# EAGLE design PCB V1 (EAGLE 9.7.0)
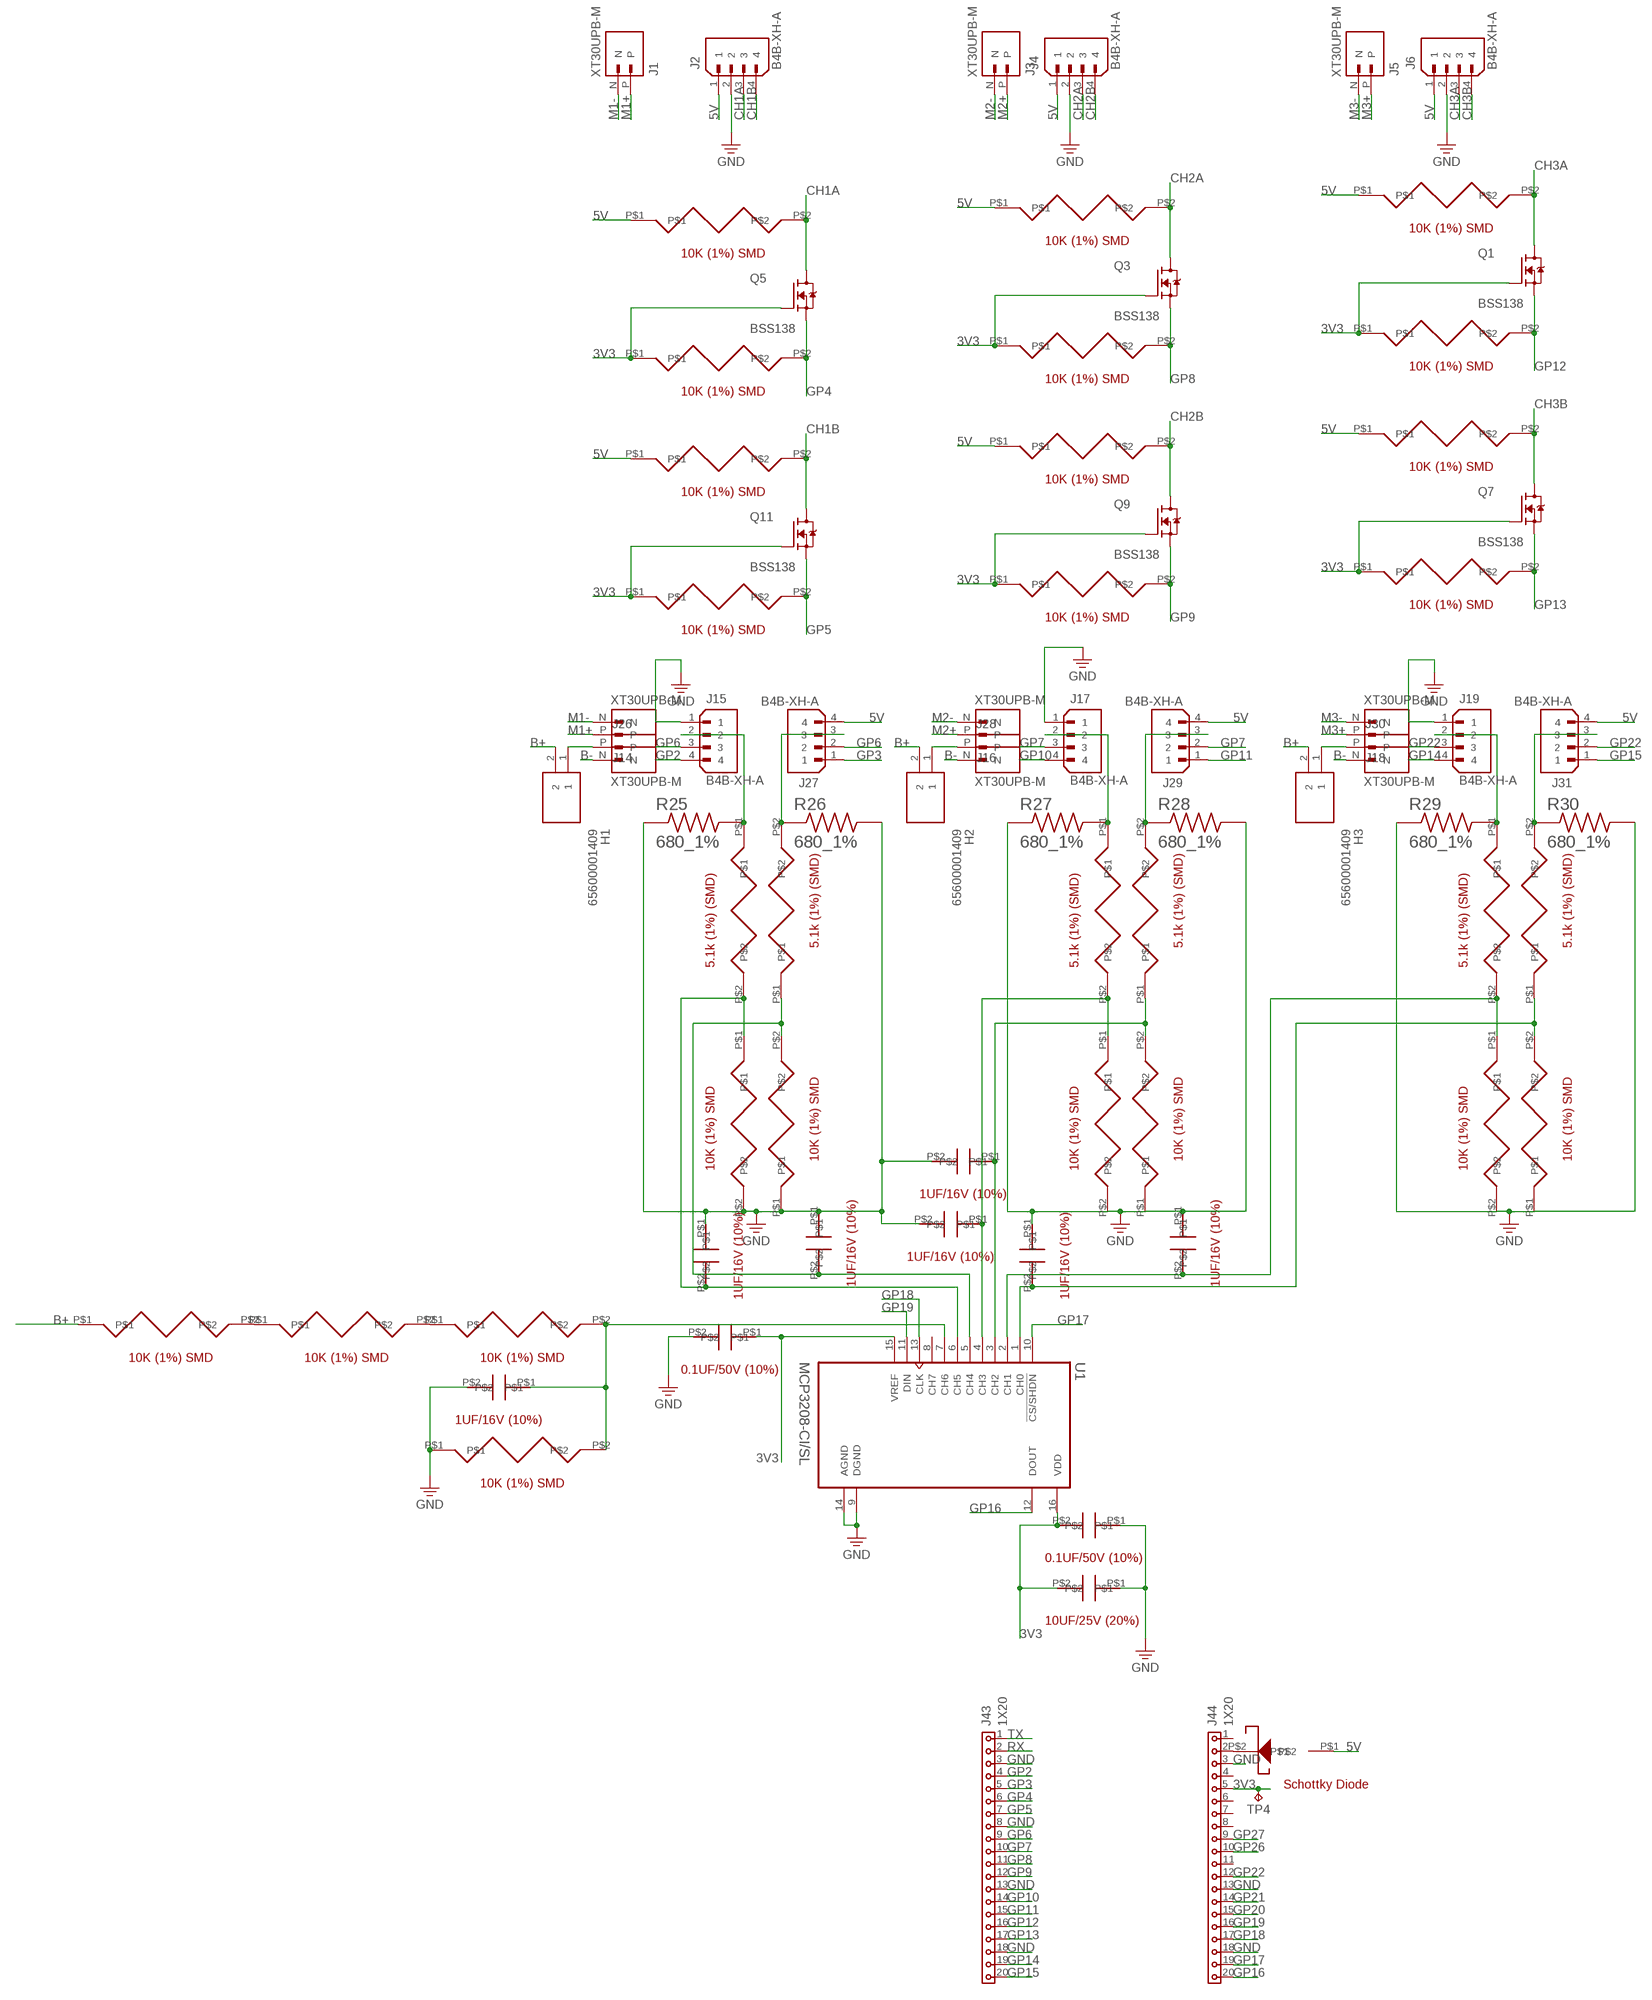
[diagram p0: schematic, sheet 1, part 1 of 2]
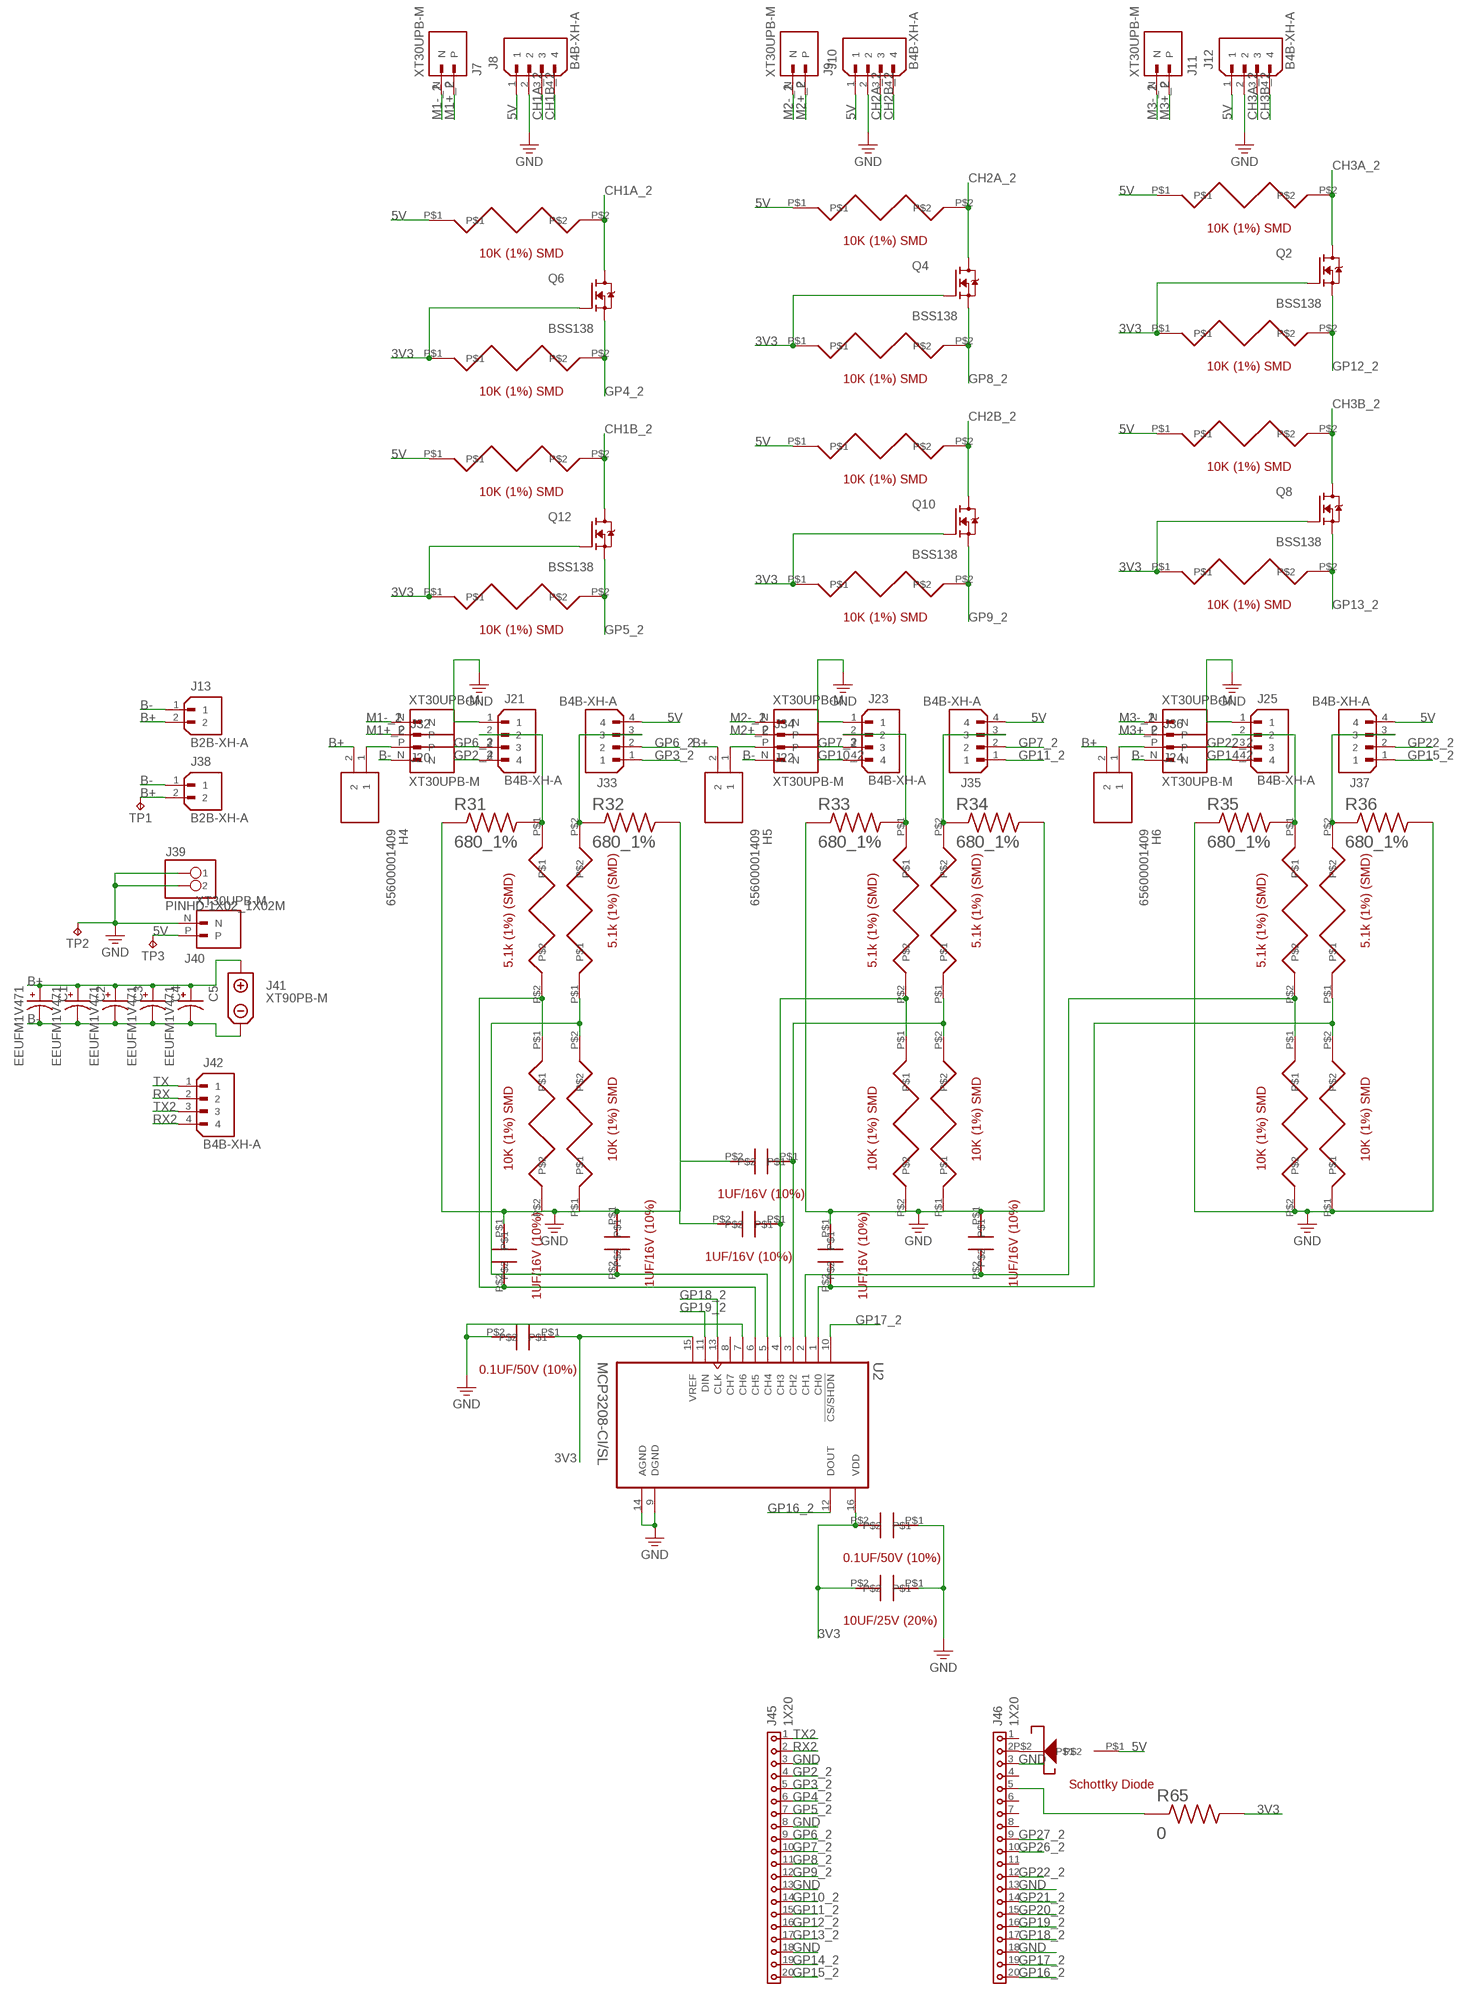
[diagram p1: schematic, sheet 1, part 2 of 2]

## Parts
C1  EEUFM1V471  [EEU-FM1V471]
C2  EEUFM1V471  [EEU-FM1V471]
C3  EEUFM1V471  [EEU-FM1V471]
C4  EEUFM1V471  [EEU-FM1V471]
C5  EEUFM1V471  [EEU-FM1V471]
C6  1UF/16V_10%  [1UF/16V_10%]
C7  1UF/16V_10%  [1UF/16V_10%]
C8  1UF/16V_10%  [1UF/16V_10%]
C9  1UF/16V_10%  [1UF/16V_10%]
C10  1UF/16V_10%  [1UF/16V_10%]
C11  1UF/16V_10%  [1UF/16V_10%]
C12  1UF/16V_10%  [1UF/16V_10%]
C13  1UF/16V_10%  [1UF/16V_10%]
C14  1UF/16V_10%  [1UF/16V_10%]
C15  1UF/16V_10%  [1UF/16V_10%]
C16  1UF/16V_10%  [1UF/16V_10%]
C17  1UF/16V_10%  [1UF/16V_10%]
C18  0.1UF/50V_10%  [0.1UF/50V_10%]
C19  0.1UF/50V_10%  [0.1UF/50V_10%]
C20  1UF/16V_10%  [1UF/16V_10%]
C21  0.1UF/50V_10%  [0.1UF/50V_10%]
C22  0.1UF/50V_10%  [0.1UF/50V_10%]
C23  10UF/25V_20%  [10UF/25V_20%]
C24  10UF/25V_20%  [10UF/25V_20%]
D1  1N5820_DIODE  [1N5820_DIODE]
D2  1N5820_DIODE  [1N5820_DIODE]
H1  65600001409  [65600001409]
H2  65600001409  [65600001409]
H3  65600001409  [65600001409]
H4  65600001409  [65600001409]
H5  65600001409  [65600001409]
H6  65600001409  [65600001409]
J1  XT30UPB-M  [XT30UPB-M]
J2  B4B-XH-A  [B4B-XH-A]
J3  XT30UPB-M  [XT30UPB-M]
J4  B4B-XH-A  [B4B-XH-A]
J5  XT30UPB-M  [XT30UPB-M]
J6  B4B-XH-A  [B4B-XH-A]
J7  XT30UPB-M  [XT30UPB-M]
J8  B4B-XH-A  [B4B-XH-A]
J9  XT30UPB-M  [XT30UPB-M]
J10  B4B-XH-A  [B4B-XH-A]
J11  XT30UPB-M  [XT30UPB-M]
J12  B4B-XH-A  [B4B-XH-A]
J13  B2B-XH-A  [B2B-XH-A]
J14  XT30UPB-M  [XT30UPB-M]
J15  B4B-XH-A  [B4B-XH-A]
J16  XT30UPB-M  [XT30UPB-M]
J17  B4B-XH-A  [B4B-XH-A]
J18  XT30UPB-M  [XT30UPB-M]
J19  B4B-XH-A  [B4B-XH-A]
J20  XT30UPB-M  [XT30UPB-M]
J21  B4B-XH-A  [B4B-XH-A]
J22  XT30UPB-M  [XT30UPB-M]
J23  B4B-XH-A  [B4B-XH-A]
J24  XT30UPB-M  [XT30UPB-M]
J25  B4B-XH-A  [B4B-XH-A]
J26  XT30UPB-M  [XT30UPB-M]
J27  B4B-XH-A  [B4B-XH-A]
J28  XT30UPB-M  [XT30UPB-M]
J29  B4B-XH-A  [B4B-XH-A]
J30  XT30UPB-M  [XT30UPB-M]
J31  B4B-XH-A  [B4B-XH-A]
J32  XT30UPB-M  [XT30UPB-M]
J33  B4B-XH-A  [B4B-XH-A]
J34  XT30UPB-M  [XT30UPB-M]
J35  B4B-XH-A  [B4B-XH-A]
J36  XT30UPB-M  [XT30UPB-M]
J37  B4B-XH-A  [B4B-XH-A]
J38  B2B-XH-A  [B2B-XH-A]
J39  PINHD-1X02_1X02M  [1X02]
J40  XT30UPB-M  [XT30UPB-M]
J41  XT90PB-M  [XT90PB-M]
J42  B4B-XH-A  [B4B-XH-A]
J43  1X20  [1X20]
J44  1X20  [1X20]
J45  1X20  [1X20]
J46  1X20  [1X20]
Q1  BSS138  [BSS138]
Q2  BSS138  [BSS138]
Q3  BSS138  [BSS138]
Q4  BSS138  [BSS138]
Q5  BSS138  [BSS138]
Q6  BSS138  [BSS138]
Q7  BSS138  [BSS138]
Q8  BSS138  [BSS138]
Q9  BSS138  [BSS138]
Q10  BSS138  [BSS138]
Q11  BSS138  [BSS138]
Q12  BSS138  [BSS138]
R1  10K_1%_SMD  [10K_1%_SMD]
R2  10K_1%_SMD  [10K_1%_SMD]
R3  10K_1%_SMD  [10K_1%_SMD]
R4  10K_1%_SMD  [10K_1%_SMD]
R5  10K_1%_SMD  [10K_1%_SMD]
R6  10K_1%_SMD  [10K_1%_SMD]
R7  10K_1%_SMD  [10K_1%_SMD]
R8  10K_1%_SMD  [10K_1%_SMD]
R9  10K_1%_SMD  [10K_1%_SMD]
R10  10K_1%_SMD  [10K_1%_SMD]
R11  10K_1%_SMD  [10K_1%_SMD]
R12  10K_1%_SMD  [10K_1%_SMD]
R13  10K_1%_SMD  [10K_1%_SMD]
R14  10K_1%_SMD  [10K_1%_SMD]
R15  10K_1%_SMD  [10K_1%_SMD]
R16  10K_1%_SMD  [10K_1%_SMD]
R17  10K_1%_SMD  [10K_1%_SMD]
R18  10K_1%_SMD  [10K_1%_SMD]
R19  10K_1%_SMD  [10K_1%_SMD]
R20  10K_1%_SMD  [10K_1%_SMD]
R21  10K_1%_SMD  [10K_1%_SMD]
R22  10K_1%_SMD  [10K_1%_SMD]
R23  10K_1%_SMD  [10K_1%_SMD]
R24  10K_1%_SMD  [10K_1%_SMD]
R25  680_1%  [680_1%]
R26  680_1%  [680_1%]
R27  680_1%  [680_1%]
R28  680_1%  [680_1%]
R29  680_1%  [680_1%]
R30  680_1%  [680_1%]
R31  680_1%  [680_1%]
R32  680_1%  [680_1%]
R33  680_1%  [680_1%]
R34  680_1%  [680_1%]
R35  680_1%  [680_1%]
R36  680_1%  [680_1%]
R37  5.1K_1%_SMD  [5.1K_1%_SMD]
R38  5.1K_1%_SMD  [5.1K_1%_SMD]
R39  5.1K_1%_SMD  [5.1K_1%_SMD]
R40  5.1K_1%_SMD  [5.1K_1%_SMD]
R41  5.1K_1%_SMD  [5.1K_1%_SMD]
R42  5.1K_1%_SMD  [5.1K_1%_SMD]
R43  5.1K_1%_SMD  [5.1K_1%_SMD]
R44  5.1K_1%_SMD  [5.1K_1%_SMD]
R45  5.1K_1%_SMD  [5.1K_1%_SMD]
R46  5.1K_1%_SMD  [5.1K_1%_SMD]
R47  5.1K_1%_SMD  [5.1K_1%_SMD]
R48  5.1K_1%_SMD  [5.1K_1%_SMD]
R49  10K_1%_SMD  [10K_1%_SMD]
R50  10K_1%_SMD  [10K_1%_SMD]
R51  10K_1%_SMD  [10K_1%_SMD]
R52  10K_1%_SMD  [10K_1%_SMD]
R53  10K_1%_SMD  [10K_1%_SMD]
R54  10K_1%_SMD  [10K_1%_SMD]
R55  10K_1%_SMD  [10K_1%_SMD]
R56  10K_1%_SMD  [10K_1%_SMD]
R57  10K_1%_SMD  [10K_1%_SMD]
R58  10K_1%_SMD  [10K_1%_SMD]
R59  10K_1%_SMD  [10K_1%_SMD]
R60  10K_1%_SMD  [10K_1%_SMD]
R61  10K_1%_SMD  [10K_1%_SMD]
R62  10K_1%_SMD  [10K_1%_SMD]
R63  10K_1%_SMD  [10K_1%_SMD]
R64  10K_1%_SMD  [10K_1%_SMD]
R65  0  RC0603JR-070RL  [RESC1607X60N]
TP1  TPTP127R  [TP127R]
TP2  TPTP127R  [TP127R]
TP3  TPTP127R  [TP127R]
TP4  TPTP127R  [TP127R]
U1  MCP3208-CI/SL  [MCP3208-CI/SL]
U2  MCP3208-CI/SL  [MCP3208-CI/SL]

## Nets
3V3: C18.P$1 C19.P$1 C21.P$2 C22.P$2 C23.P$2 C24.P$2 J44.5 Q1.1(G) Q2.1(G) Q3.1(G) Q4.1(G) Q5.1(G) Q6.1(G) Q7.1(G) Q8.1(G) Q9.1(G) Q10.1(G) Q11.1(G) Q12.1(G) R7.P$1 R8.P$1 R9.P$1 R10.P$1 R11.P$1 R12.P$1 R19.P$1 R20.P$1 R21.P$1 R22.P$1 R23.P$1 R24.P$1 R65.2 TP4.TP U1.15(VREF) U1.16(VDD) U2.15(VREF) U2.16(VDD)
5V [5v]: D1.P$1 D2.P$1 J2.1 J4.1 J6.1 J8.1 J10.1 J12.1 J27.4 J29.4 J31.4 J33.4 J35.4 J37.4 J40.P R1.P$1 R2.P$1 R3.P$1 R4.P$1 R5.P$1 R6.P$1 R13.P$1 R14.P$1 R15.P$1 R16.P$1 R17.P$1 R18.P$1 TP3.TP
B+ [battery]: C1.P C2.P C3.P C4.P C5.P H1.2 H2.2 H3.2 H4.2 H5.2 H6.2 J13.2 J38.2 J41.+ R61.P$1 TP1.TP
B- [battery]: C1.N C2.N C3.N C4.N C5.N J13.1 J26.N J28.N J30.N J32.N J34.N J36.N J38.1 J41.-
CH1A: J2.3 Q5.3(D) R5.P$2
CH1A_2: J8.3 Q6.3(D) R6.P$2
CH1B: J2.4 Q11.3(D) R17.P$2
CH1B_2: J8.4 Q12.3(D) R18.P$2
CH2A: J4.3 Q3.3(D) R3.P$2
CH2A_2: J10.3 Q4.3(D) R4.P$2
CH2B: J4.4 Q9.3(D) R15.P$2
CH2B_2: J10.4 Q10.3(D) R16.P$2
CH3A: J6.3 Q1.3(D) R1.P$2
CH3A_2: J12.3 Q2.3(D) R2.P$2
CH3B: J6.4 Q7.3(D) R13.P$2
CH3B_2: J12.4 Q8.3(D) R14.P$2
GND: C6.P$2 C7.P$2 C8.P$1 C9.P$1 C10.P$1 C11.P$1 C12.P$1 C13.P$2 C14.P$1 C15.P$1 C16.P$2 C17.P$1 C18.P$2 C19.P$2 C20.P$2 C21.P$1 C22.P$1 C23.P$1 C24.P$1 J2.2 J4.2 J6.2 J8.2 J10.2 J12.2 J15.1 J17.1 J19.1 J21.1 J23.1 J25.1 J39.1 J39.2 J40.N J43.3 J43.8 J43.13 J43.18 J44.3 J44.13 J44.18 J45.3 J45.8 J45.13 J45.18 J46.3 J46.13 J46.18 R25.1 R26.2 R27.1 R28.2 R29.1 R30.2 R31.1 R32.2 R33.1 R34.2 R35.1 R36.2 R49.P$2 R50.P$1 R51.P$2 R52.P$1 R53.P$2 R54.P$1 R55.P$2 R56.P$1 R57.P$2 R58.P$1 R59.P$2 R60.P$1 R64.P$1 TP2.TP U1.9(DGND) U1.14(AGND) U2.7(CH6) U2.9(DGND) U2.14(AGND)
GP2: J15.4 J43.4
GP2_2: J21.4 J45.4
GP3: J27.1 J43.5
GP3_2: J33.1 J45.5
GP4: J43.6 Q5.2(S) R11.P$2
GP4_2: J45.6 Q6.2(S) R12.P$2
GP5: J43.7 Q11.2(S) R23.P$2
GP5_2: J45.7 Q12.2(S) R24.P$2
GP6: J15.3 J27.2 J43.9
GP6_2: J21.3 J33.2 J45.9
GP7: J17.3 J29.2 J43.10
GP7_2: J23.3 J35.2 J45.10
GP8: J43.11 Q3.2(S) R9.P$2
GP8_2: J45.11 Q4.2(S) R10.P$2
GP9: J43.12 Q9.2(S) R21.P$2
GP9_2: J45.12 Q10.2(S) R22.P$2
GP10: J17.4 J43.14
GP10_2: J23.4 J45.14
GP11: J29.1 J43.15
GP11_2: J35.1 J45.15
GP12: J43.16 Q1.2(S) R7.P$2
GP12_2: J45.16 Q2.2(S) R8.P$2
GP13: J43.17 Q7.2(S) R19.P$2
GP13_2: J45.17 Q8.2(S) R20.P$2
GP14: J19.4 J43.19
GP14_2: J25.4 J45.19
GP15: J31.1 J43.20
GP15_2: J37.1 J45.20
GP16: J44.20 U1.12(DOUT)
GP16_2: J46.20 U2.12(DOUT)
GP17: J44.19 U1.10(!CS/SHDN)
GP17_2: J46.19 U2.10(!CS/SHDN)
GP18: J44.17 U1.13(CLK)
GP18_2: J46.17 U2.13(CLK)
GP19: J44.16 U1.11(DIN)
GP19_2: J46.16 U2.11(DIN)
GP20: J44.15
GP20_2: J46.15
GP21: J44.14
GP21_2: J46.14
GP22: J19.3 J31.2 J44.12
GP22_2: J25.3 J37.2 J46.12
GP26: J44.10
GP26_2: J46.10
GP27: J44.9
GP27_2: J46.9
M1+ [motor]: J1.P J14.P
M1+_2 [motor]: J7.P J20.P
M1- [motor]: J1.N J14.N
M1-_2 [motor]: J7.N J20.N
M2+ [motor]: J3.P J16.P
M2+_2 [motor]: J9.P J22.P
M2- [motor]: J3.N J16.N
M2-_2 [motor]: J9.N J22.N
M3+ [motor]: J5.P J18.P
M3+_2 [motor]: J11.P J24.P
M3- [motor]: J5.N J18.N
M3-_2 [motor]: J11.N J24.N
N$1: D1.P$2 J44.2
N$2: D2.P$2 J46.2
N$3: J17.2 R27.2 R39.P$1
N$4: J29.3 R28.1 R40.P$2
N$5: J15.2 R25.2 R37.P$1
N$6: C6.P$1 R40.P$1 R52.P$2 U1.3(CH2)
N$7: C13.P$1 R39.P$2 R51.P$1 U1.4(CH3)
N$8: J27.3 R26.1 R38.P$2
N$9: C8.P$2 R38.P$1 R50.P$2 U1.5(CH4)
N$10: C12.P$2 R37.P$2 R49.P$1 U1.6(CH5)
N$11: J19.2 R29.2 R41.P$1
N$12: J31.3 R30.1 R42.P$2
N$13: C14.P$2 R42.P$1 R54.P$2 U1.1(CH0)
N$14: C9.P$2 R41.P$2 R53.P$1 U1.2(CH1)
N$15 [battery]: H4.1 J32.P
N$16: J23.2 R33.2 R45.P$1
N$17: J35.3 R34.1 R46.P$2
N$18: C7.P$1 R46.P$1 R58.P$2 U2.3(CH2)
N$19: C16.P$1 R45.P$2 R57.P$1 U2.4(CH3)
N$20: J21.2 R31.2 R43.P$1
N$21: J33.3 R32.1 R44.P$2
N$22: C10.P$2 R44.P$1 R56.P$2 U2.5(CH4)
N$23: C15.P$2 R43.P$2 R55.P$1 U2.6(CH5)
N$24: J25.2 R35.2 R47.P$1
N$25: J37.3 R36.1 R48.P$2
N$26: C17.P$2 R48.P$1 R60.P$2 U2.1(CH0)
N$27: C11.P$2 R47.P$2 R59.P$1 U2.2(CH1)
N$28 [battery]: H5.1 J34.P
N$29 [battery]: H6.1 J36.P
N$30 [battery]: H3.1 J30.P
N$31 [battery]: H2.1 J28.P
N$32 [battery]: H1.1 J26.P
N$33: J46.5 R65.1
N$34: R62.P$2 R63.P$1
N$35: R61.P$2 R62.P$1
N$37: C20.P$1 R63.P$2 R64.P$2 U1.7(CH6)
RX: J42.2 J43.2
RX2: J42.4 J45.2
TX: J42.1 J43.1
TX2: J42.3 J45.1
Unconnected: J44.1 J44.4 J44.6 J44.7 J44.8 J44.11 J46.1 J46.4 J46.6 J46.7 J46.8 J46.11 U1.8(CH7) U2.8(CH7)

## Library data of the parts
C1-C5 = EEUFM1V471:EEUFM1V471: Check availability <https://pricing.snapeda.com/parts/EEU-FM1V471/Panasonic%20Electronic/view-part?ref=eda>
C6-C17 C20 = Custom Capacitor Library:1UF/16V_10%
C18 C19 C21 C22 = Custom Capacitor Library:0.1UF/50V_10%
C23 C24 = Custom Capacitor Library:10UF/25V_20%
D1 D2 = 1N5820_DIODE:1N5820_DIODE
H1-H6 = 65600001409:65600001409: Molded Base PC Mount Fuse Block For 5 20mm Fuses Source: Datasheet <https://www.littelfuse.com/media?resourcetype=datasheets&itemid=7143dbe7-66cc-46d0-a668-04c7d18969fc&filename=littelfuse-fuse-block-656-datasheet>
J1 J3 J5 J7 J9 J11 J14 J16 J18 J20 J22 J24 J26 J28 J30 J32 J34 J36 J40 = XT30UPB-M:XT30UPB-M
J2 J4 J6 J8 J10 J12 J15 J17 J19 J21 J23 J25 J27 J29 J31 J33 J35 J37 J42 = B4B-XH-A:B4B-XH-A
J13 J38 = B2B-XH-A:B2B-XH-A
J39 = Tinkercad:PINHD-1X02
J41 = XT30-60-90:XT90
J43-J46 = 1x20 Socket Headers:1X20
Q1-Q12 = BSS138:BSS138
R1-R24 R49-R64 = Custom Resistor Library:10K_1%_SMD
R25-R36 = 680_1%:680_1%
R37-R48 = Custom Resistor Library:5.1K_1%_SMD
R65 = RC0603JR-070RL:RC0603JR-070RL
TP1-TP4 = PCB_Utilities:TP: Test Pad
U1 U2 = MCP3208-CI_SL:MCP3208-CI/SL

## Net classes
0 default: width 0.125 mm
1 battery: width 3.75 mm, drill 0.8 mm
2 5v: width 0.25 mm
3 motor: width 3 mm, drill 0.8 mm

## Board
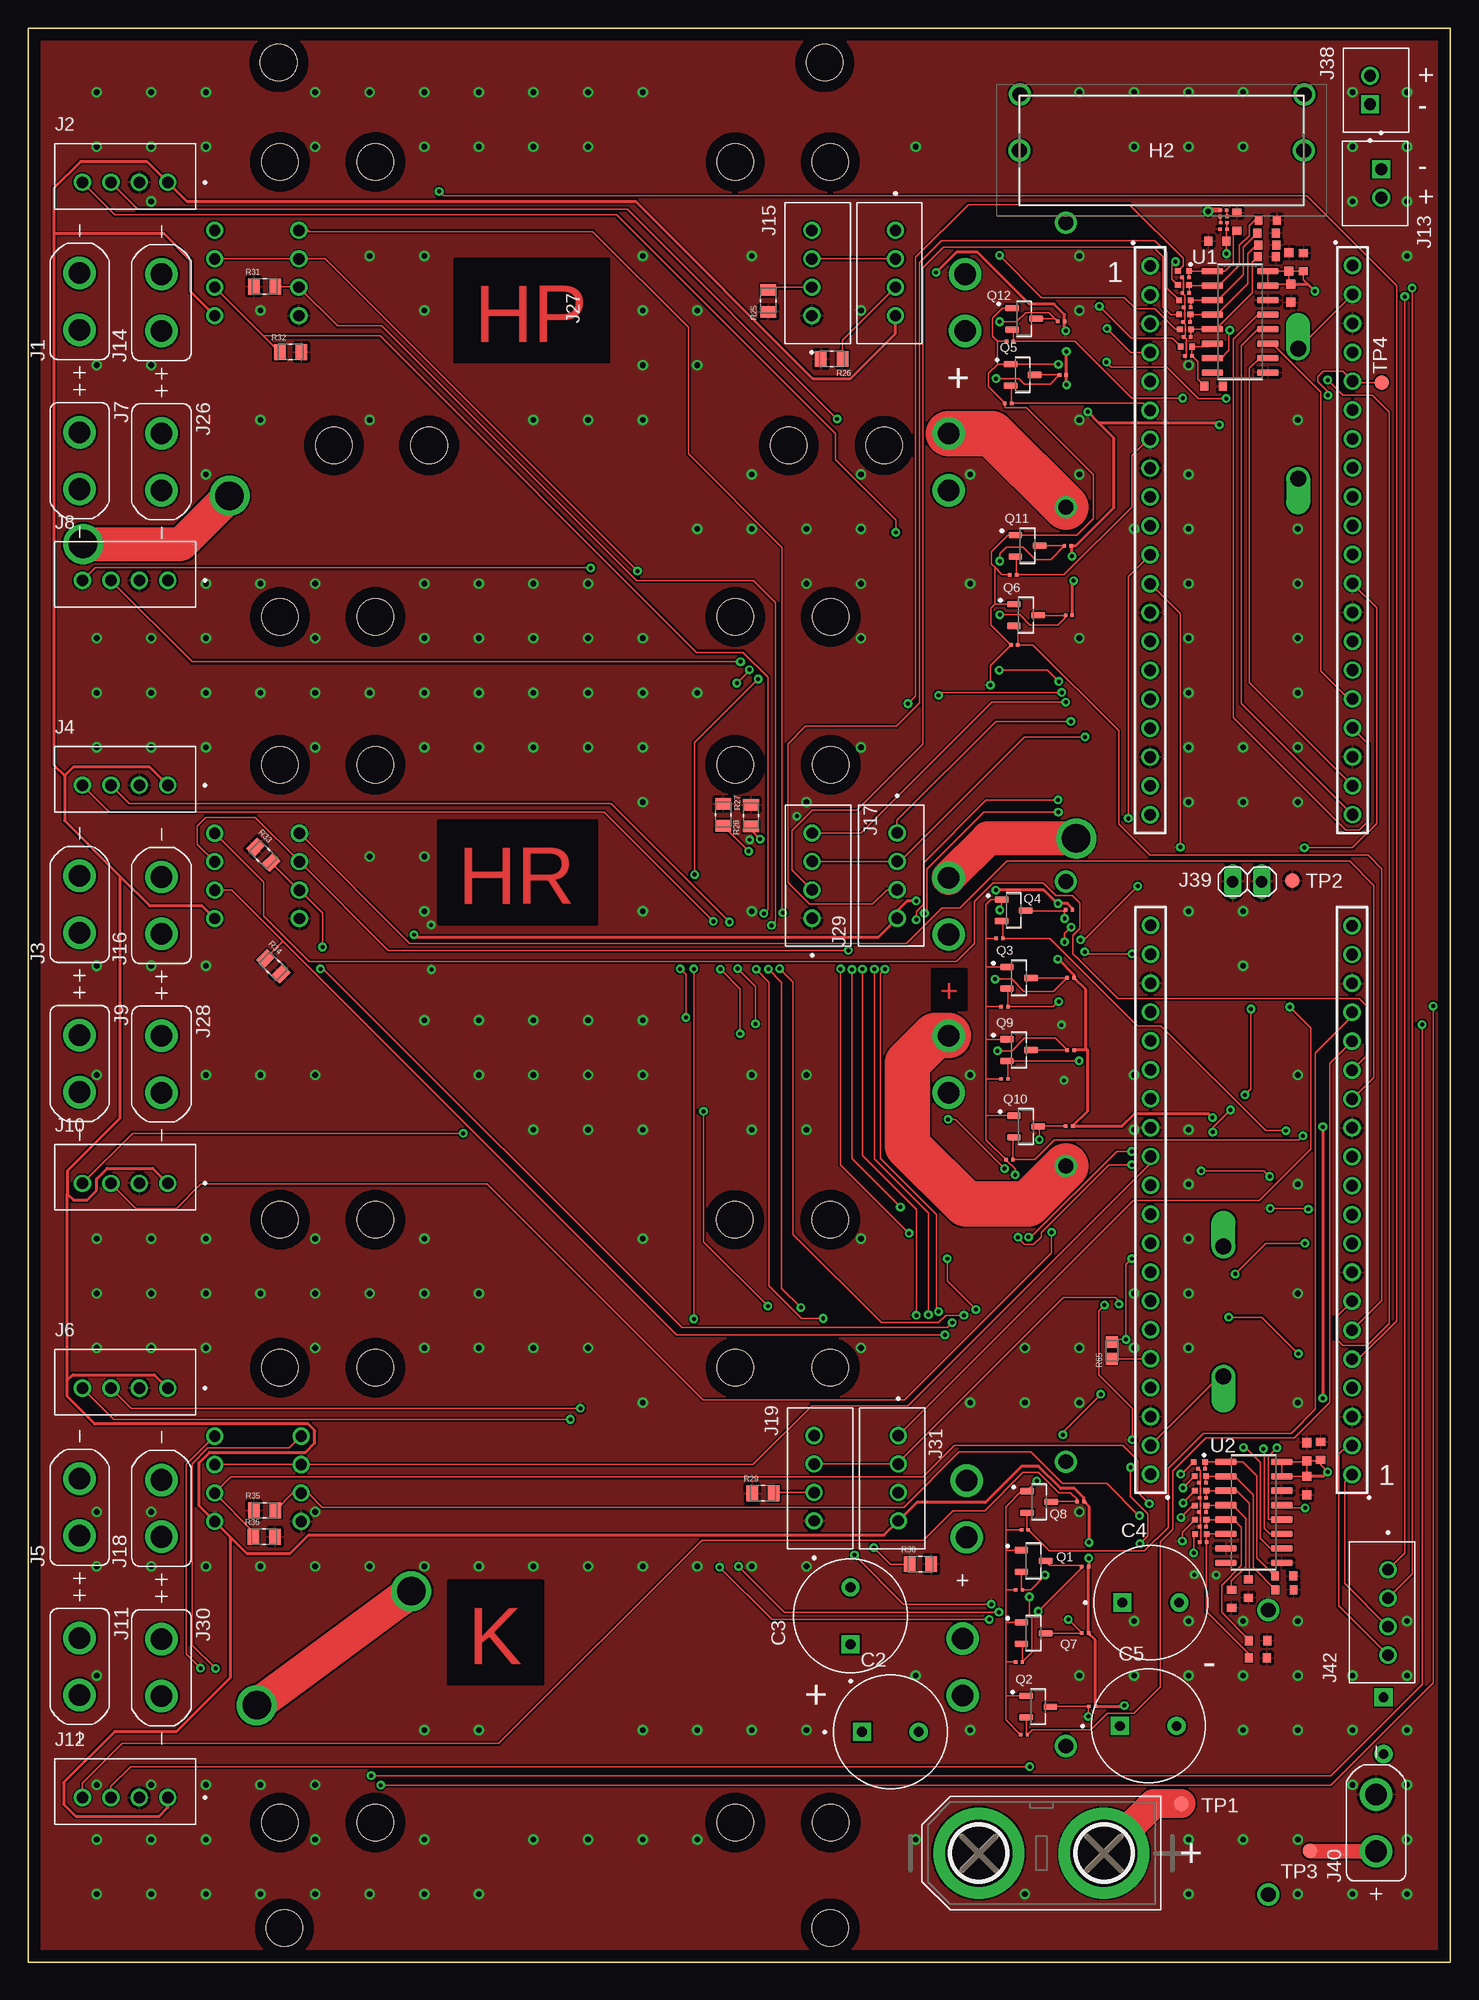
[diagram p2: board, top side]
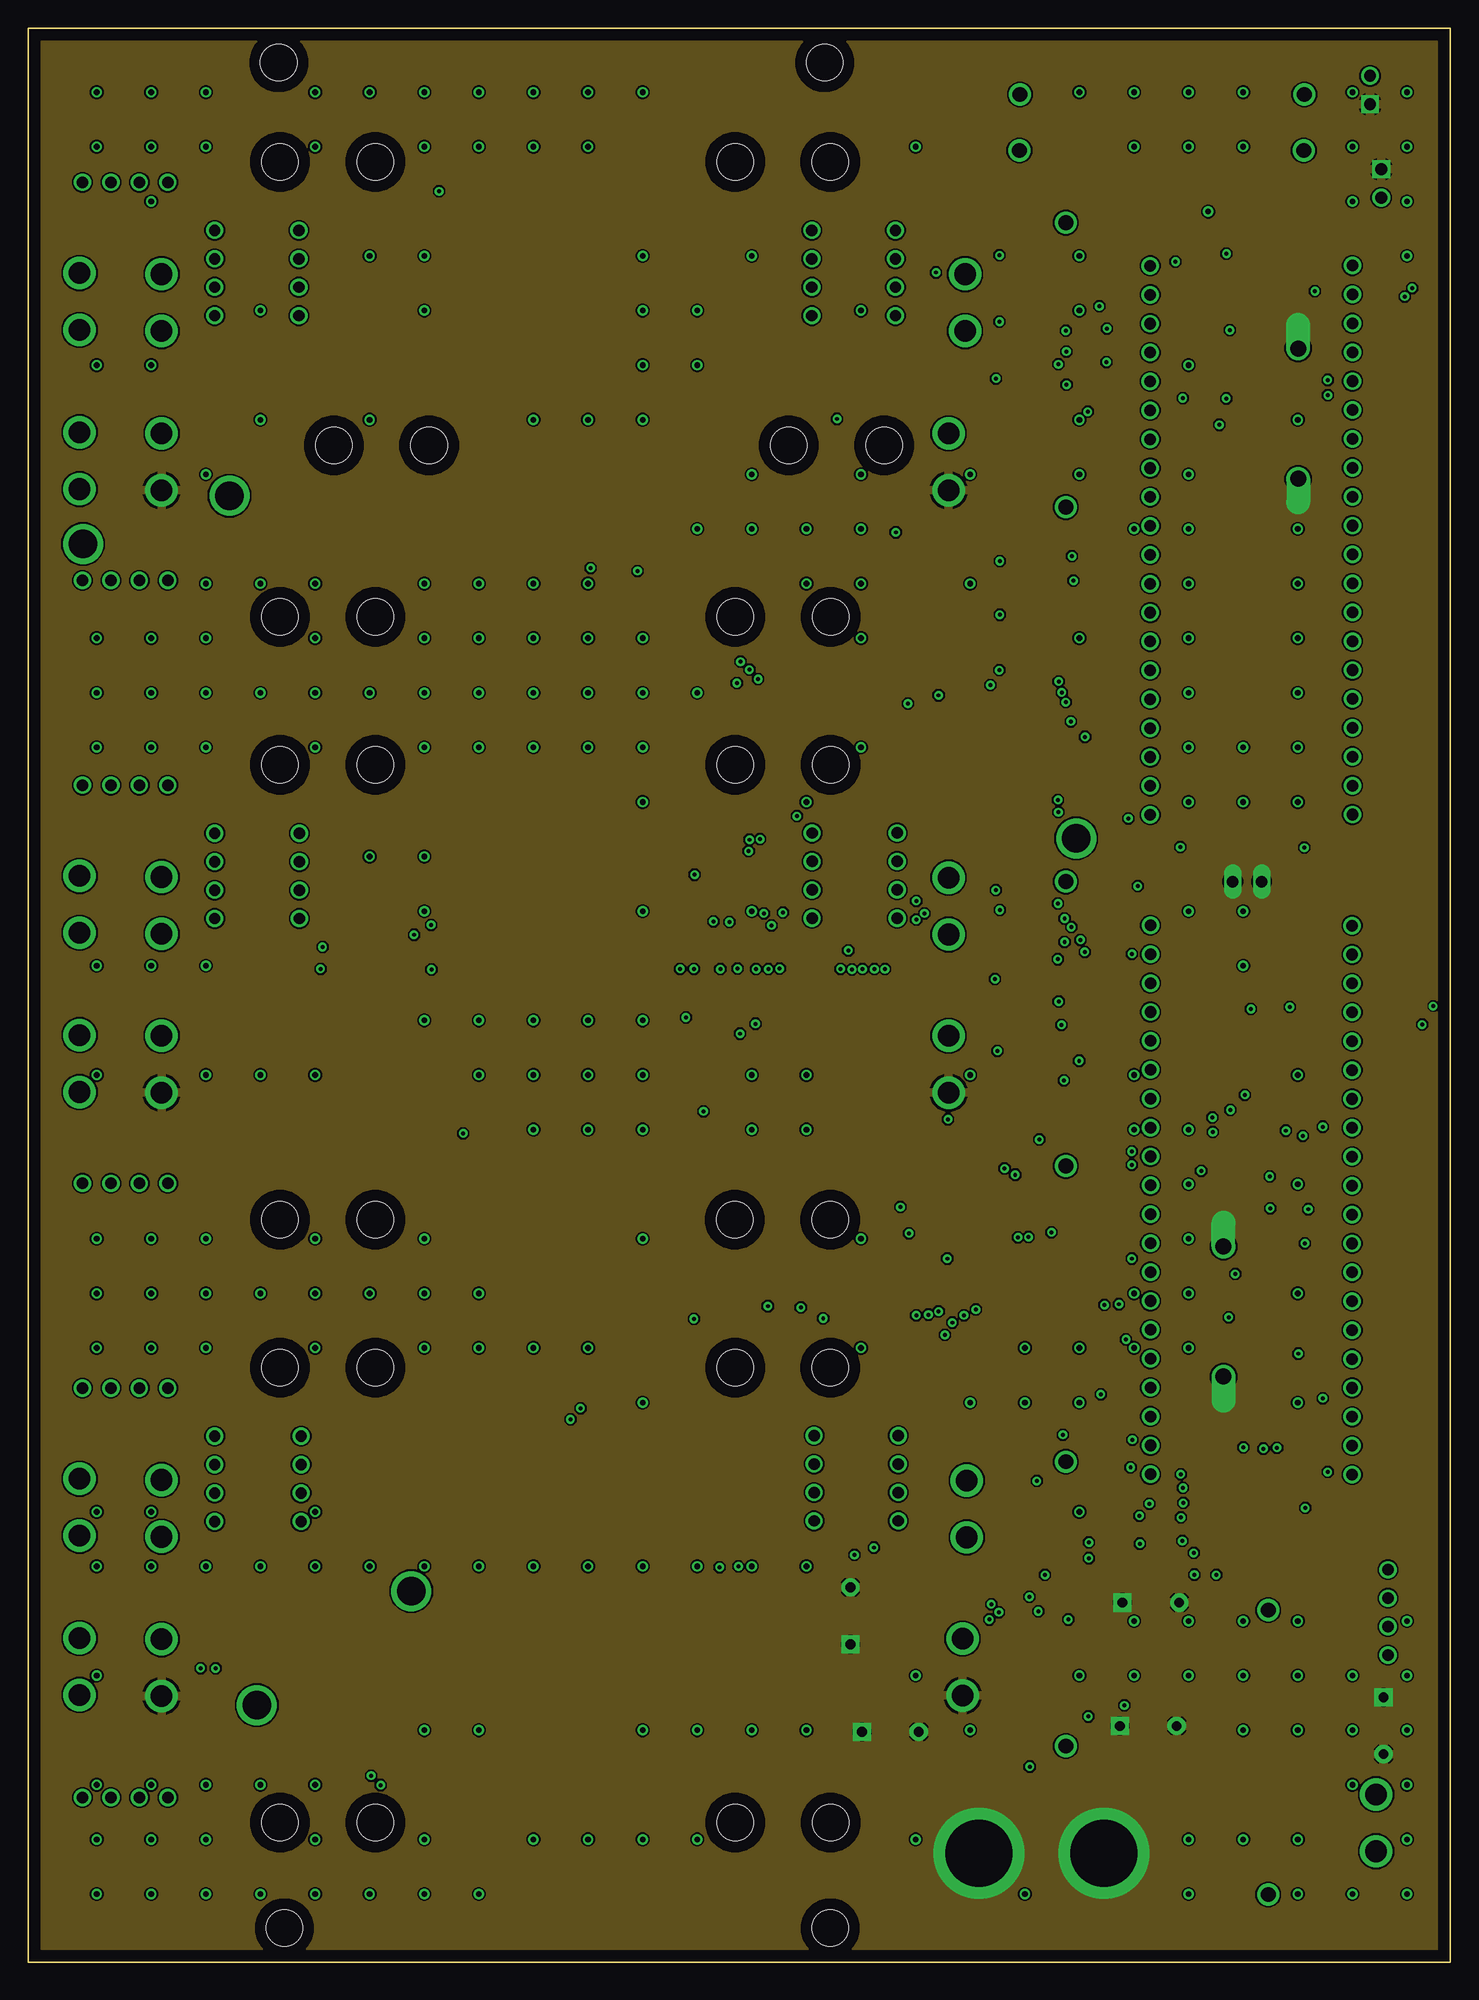
[diagram p3: board, inner layer Route2]
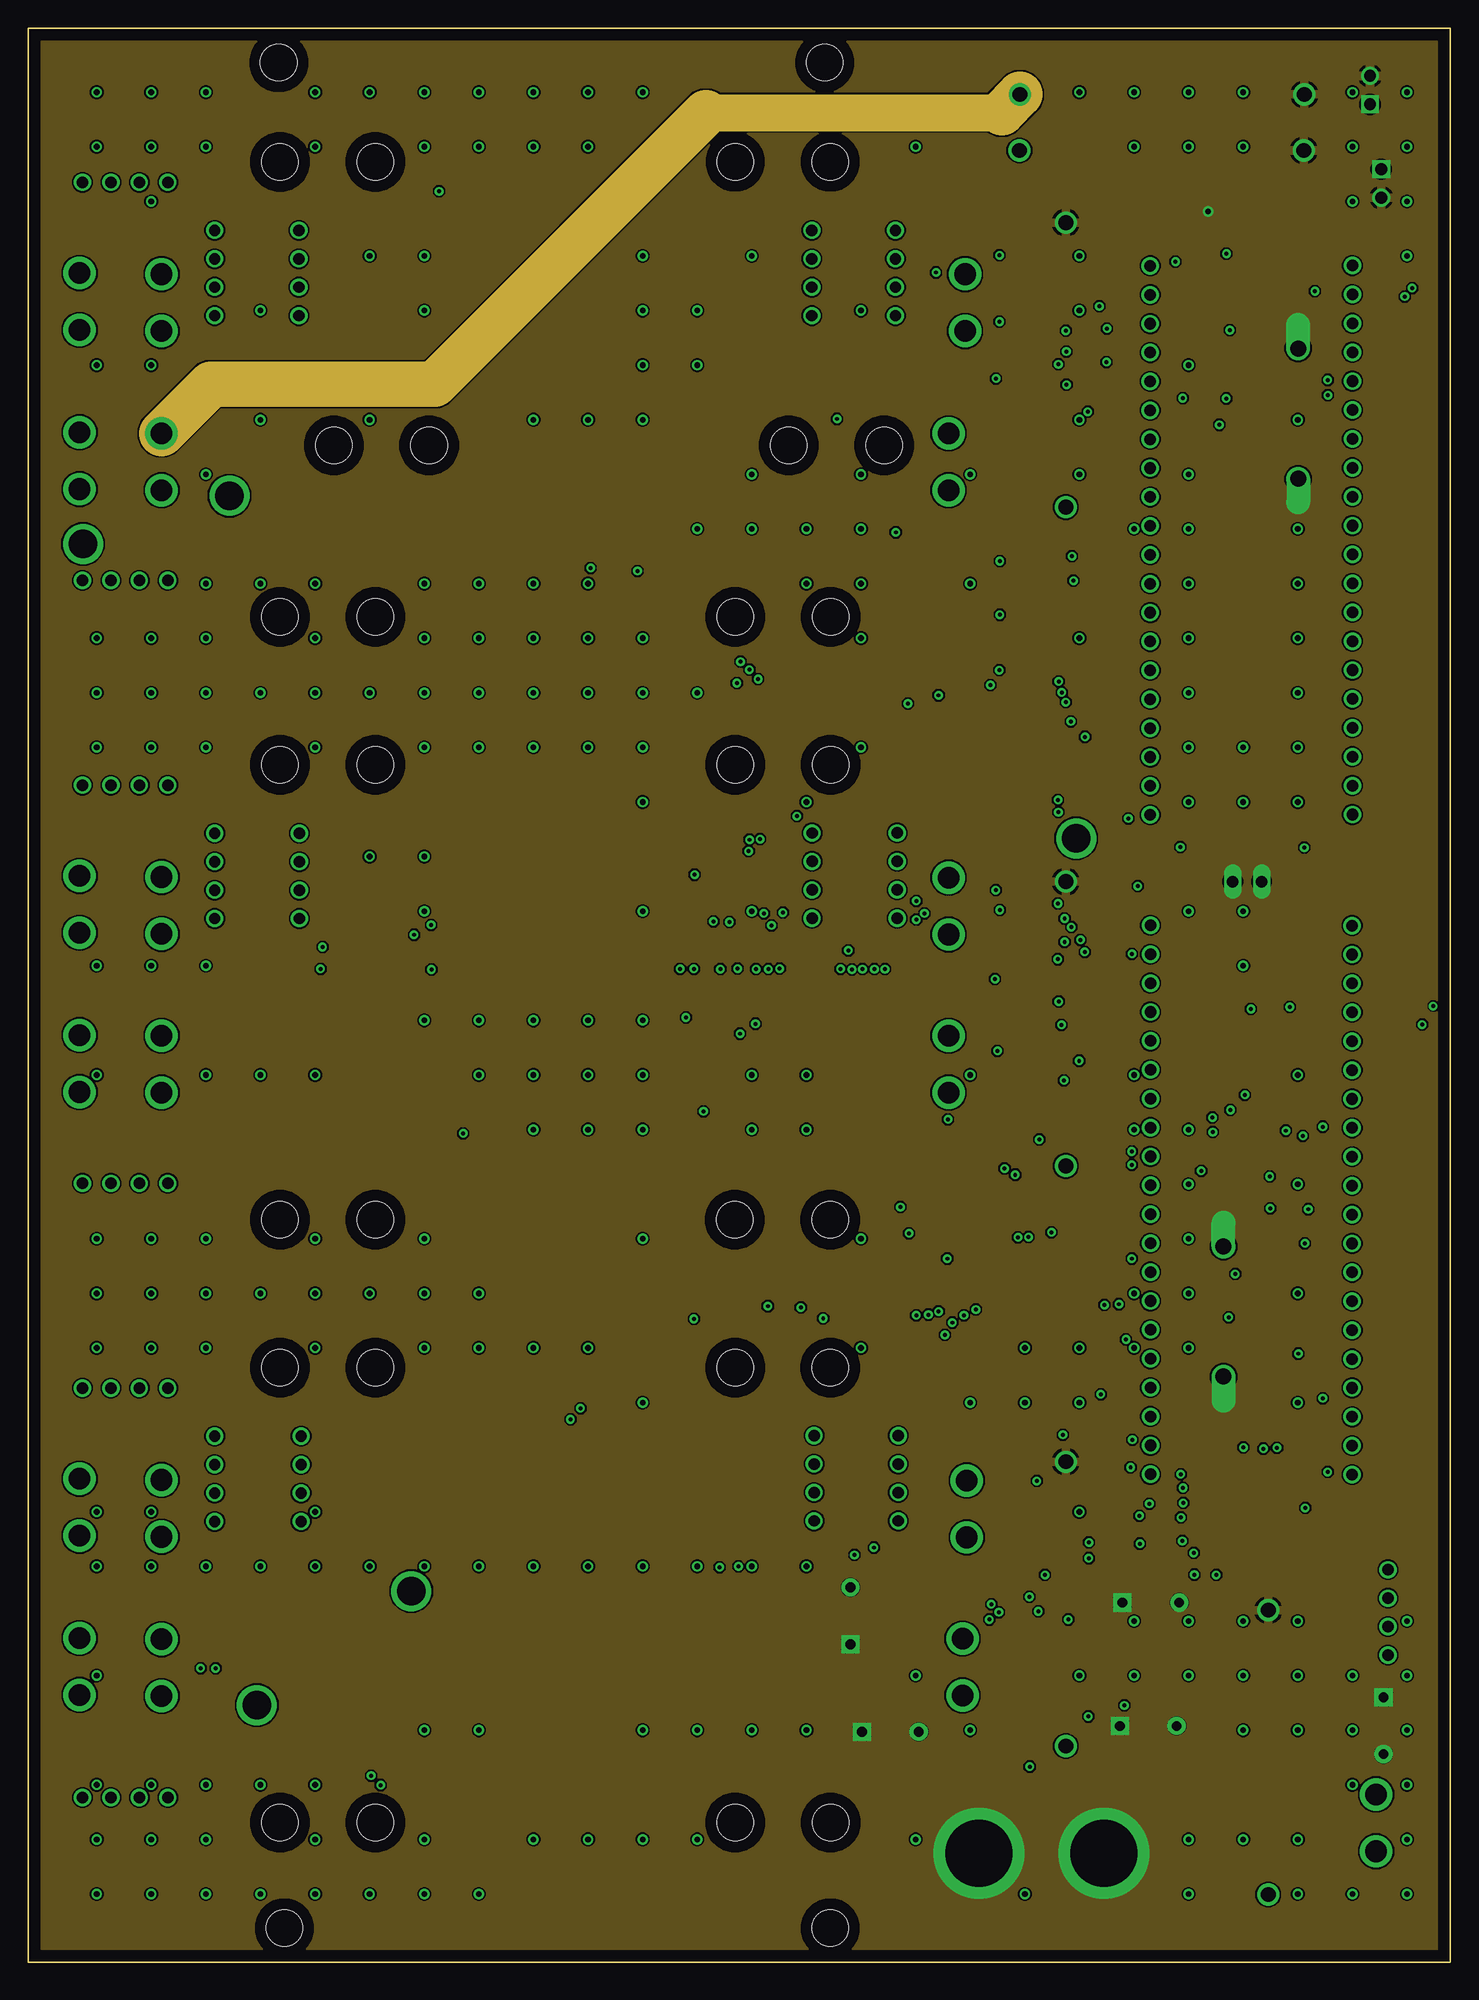
[diagram p4: board, inner layer Route63]
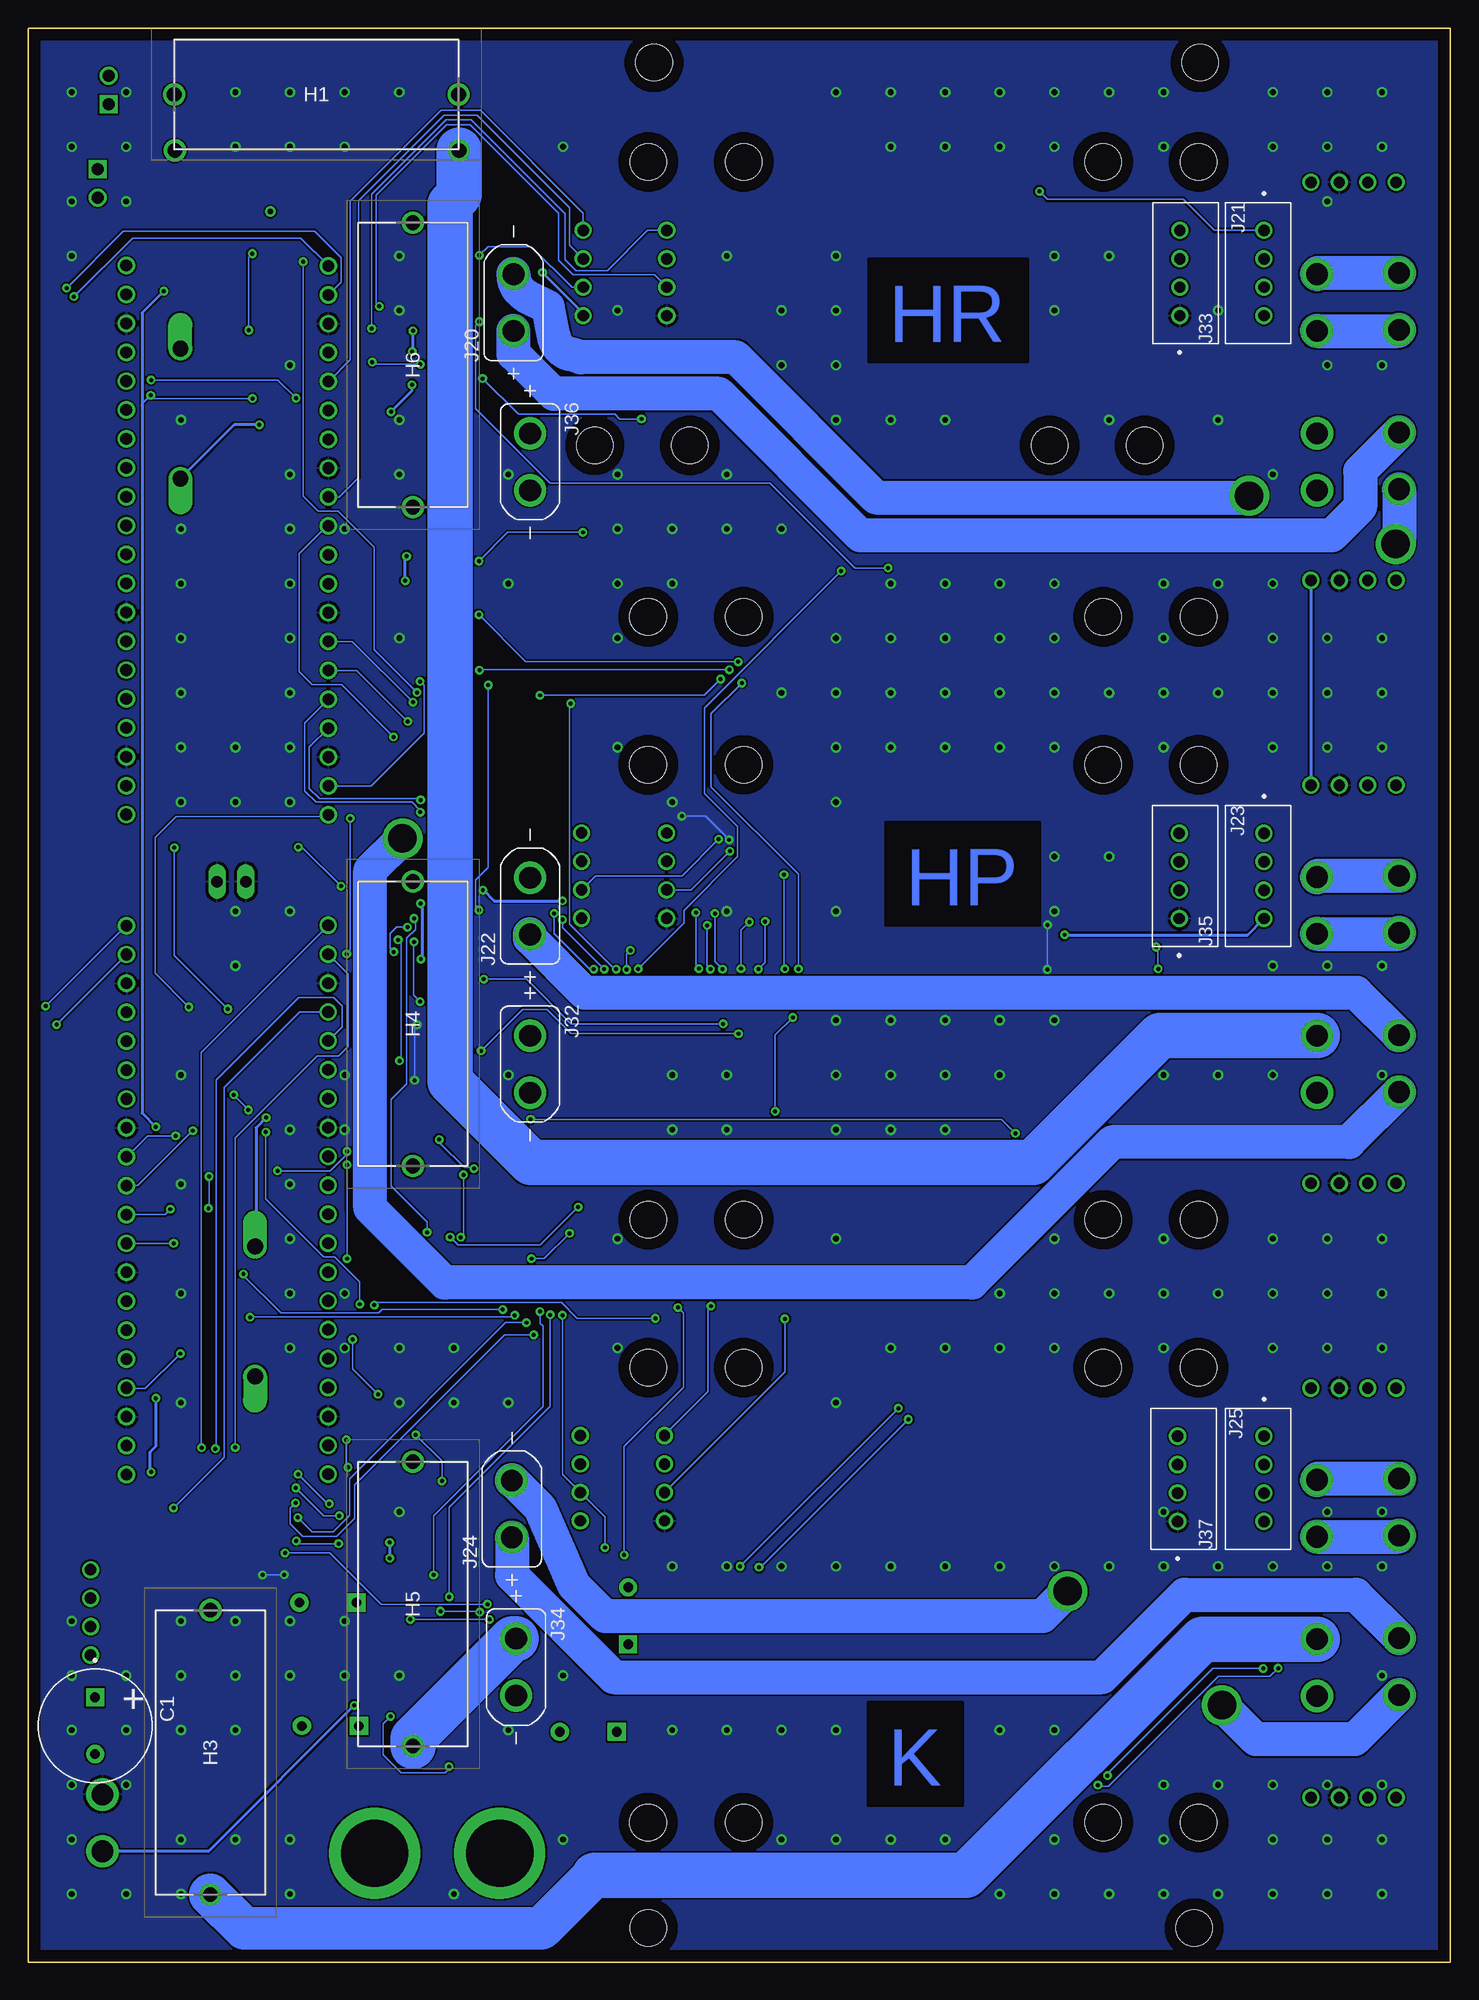
[diagram p5: board, bottom side, seen from below]

Size 125 x 170 mm. Coordinates in mm from the lower left corner, seen from the top.
Outline: 0,170 0,0 125,0 125,170 0,170
Copper layers (1+2*15+16): Top / Route2 / Route63 / Bottom
Stack-up 4 Layer Stack: Top SilkScreen Epoxy Ink / Top SolderMask User Defined 0.0254mm Dk 4.3 / Top Surface Finish Lead-Free 0.02mm / Top User Defined 0.07mm / Dielectric-1 Prepreg:001 0.064mm / Dielectric-2 Prepreg:001 0.064mm / Route2 User Defined 0.07mm / Dielectric-3 Core:066 0.711mm / Route63 User Defined 0.07mm / Dielectric-4 Prepreg:001 0.064mm / Dielectric-5 Prepreg:001 0.064mm / Bottom User Defined 0.07mm / Bottom Surface Finish Lead-Free 0.02mm / Bottom SolderMask User Defined 0.0254mm Dk 4.3 / Bottom SilkScreen Epoxy Ink
Design rules: minimum copper width classes=1 3.75mm, minimum copper width classes=3 3mm, minimum copper width classes=2 0.25mm, minimum copper width classes=0 0.125mm, minimum copper width 6mil, minimum drill size classes=1,3 0.8mm, minimum drill size 0.35mm, copper clearance wire_polygon to wire_polygon 6mil, copper clearance wire_polygon to pad_smd 6mil, copper clearance wire_polygon to via 6mil, copper clearance pad_smd to pad_smd 6mil, copper clearance pad_smd to via 6mil, copper clearance via to via 6mil, copper clearance smd to pad (same net) 6mil, copper clearance smd to via (same net) 6mil, copper clearance smd to smd (same net) 6mil, dimension clearance 40mil, via restrict clearance 0mil, restrict clearance 0mil, drill distance 6mil, keepout clearance 0mil
Holes 3.2 mm at 22,167 22.5,3 70,167 70.5,3 22.12,158.28 30.5,158.28 62.12,158.28 70.5,158.28 26.85,133.35 35.23,133.35 66.85,133.35 75.22,133.35 22.12,118.28 30.5,118.28 62.12,118.28 70.53,118.28 22.12,105.28 62.12,105.28 70.53,105.28 22.12,65.28 30.5,65.28 22.12,52.27 30.5,52.27 62.1,65.28 70.5,65.28 62.12,52.27 70.5,52.27 22.12,12.28 30.5,12.28 62.12,12.28 70.53,12.28 30.5,105.28

### Footprints (pad centres in the part's own frame; a part is rotated, then mirrored left to right if it is on the bottom)
EEU-FM1V471 = drill 0.85 pad 1.6: N 2.5,0 | drill 0.85 pad 1.6 square: P -2.5,0
1UF/16V_10% = smd 0.7 x 0.8: P$1 -0.8,0; P$2 0.8,0
0.1UF/50V_10% = smd 0.8 x 0.8: P$1 -0.8,0; P$2 0.8,0
10UF/25V_20% = smd 0.7 x 0.8: P$1 -0.8,0; P$2 0.8,0
1N5820_DIODE = drill 1.4 offset: P$1 0,0; P$2 -11.43,0
65600001409 = drill 1.3 pad 1.95: 1 0,0; 2 25,0
XT30UPB-M = drill 1.9: N 2.5,0; P -2.5,0
B4B-XH-A = drill 1: 1 3.75,-0.525; 2 1.25,-0.525; 3 -1.25,-0.525; 4 -3.75,-0.525
B2B-XH-A = drill 1.05 square: 1 1.25,-0.525 | drill 1.05: 2 -1.25,-0.525
1X02 = drill 1.016 long: 1 -1.27,0; 2 1.27,0
XT90PB-M = drill 5.9 pad 8: + 5.5,0; - -5.5,0
1X20 = drill 1.02: 1 -24.13,0; 2 -21.59,0; 3 -19.05,0; 4 -16.51,0; 5 -13.97,0; 6 -11.43,0; 7 -8.89,0; 8 -6.35,0; 9 -3.81,0; 10 -1.27,0; 11 1.27,0; 12 3.81,0; 13 6.35,0; 14 8.89,0; 15 11.43,0; 16 13.97,0; 17 16.51,0; 18 19.05,0; 19 21.59,0; 20 24.13,0
BSS138 = smd 1.23 x 0.6: 1 -1.06,0.95; 2 -1.06,-0.95; 3 1.06,0
10K_1%_SMD = smd 0.3 x 0.3: P$1 -0.3,0; P$2 0.3,0
680_1% = smd 1.01 x 1.38: 1 -0.95,0; 2 0.95,0
5.1K_1%_SMD = smd 0.5 x 0.5: P$1 -0.5,0; P$2 0.5,0
RESC1607X60N = smd 1.04 x 1.02: 1 -0.735,0; 2 0.735,0
TP127R = smd 1.27 x 1.27: TP 0,0
MCP3208-CI/SL = smd 1.9 x 0.6: 1 -2.455,4.445; 2 -2.455,3.175; 3 -2.455,1.905; 4 -2.455,0.635; 5 -2.455,-0.635; 6 -2.455,-1.905; 7 -2.455,-3.175; 8 -2.455,-4.445; 9 2.455,-4.445; 10 2.455,-3.175; 11 2.455,-1.905; 12 2.455,-0.635; 13 2.455,0.635; 14 2.455,1.905; 15 2.455,3.175; 16 2.455,4.445

### Placement (x,y rotation side)
C1  119.14,20.79 270 bottom
C2  75.78,20.25 0 top
C3  72.28,30.45 90 top
C4  98.67,31.62 0 top
C5  98.45,20.78 0 top
C6  108.85,152 0 top
C7  107.25,32.85 270 top
C8  108.88,149.93 180 top
C9  108.95,153.15 180 top
C10  108.1,28.28 180 top
C11  110.42,32.75 180 top
C12  104.2,138.55 180 top
C13  108.92,150.95 0 top
C14  106.25,153 270 top
C15  108.08,26.75 180 top
C16  105.78,31.95 270 top
C17  110.4,33.95 180 top
C18  111,146.72 270 top
C19  112.4,41.9 270 top
C20  104.53,151.3 180 top
C21  110.83,149.47 270 top
C22  112.4,44.88 270 top
C23  112.1,149.45 270 top
C24  113.6,44.95 270 top
D1  111.64,130.42 270 top
D2  105.07,62.92 90 top
H1  87.17,164.2 180 bottom
H2  87.12,159.28 0 top
H3  109,5.95 90 bottom
H4  91.2,70 90 bottom
H5  91.2,19 90 bottom
H6  91.2,127.92 90 bottom
J1  4.5,146 90 top
J2  8.5,157 0 top
J3  4.5,93 90 top
J4  8.5,104 0 top
J5  4.5,40 90 top
J6  8.5,51 0 top
J7  4.5,132 270 top
J8  8.5,122 0 top
J9  4.5,79 270 top
J10  8.5,69 0 top
J11  4.5,26 270 top
J12  8.5,15 0 top
J13  118.4,156.38 90 top
J14  11.7,145.9 90 top
J15  69.4,148.5 270 top
J16  11.7,92.9 90 top
J17  69.42,95.52 270 top
J18  11.7,39.9 90 top
J19  69.6,42.55 270 top
J20  82.35,145.9 90 bottom
J21  23.25,148.5 270 bottom
J22  80.9,92.85 90 bottom
J23  23.3,95.5 270 bottom
J24  82.5,39.85 90 bottom
J25  23.45,42.5 270 bottom
J26  11.7,131.9 270 top
J27  75.7,148.5 90 top
J28  11.7,78.95 270 top
J29  75.85,95.53 90 top
J30  11.7,25.9 270 top
J31  75.95,42.55 90 top
J32  80.9,78.95 270 bottom
J33  16.9,148.5 90 bottom
J34  82.12,25.95 270 bottom
J35  16.9,95.5 90 bottom
J36  80.9,131.9 270 bottom
J37  16.9,42.5 90 bottom
J38  118.47,164.57 270 top
J39  107.15,95 0 top
J40  118.48,12.25 90 top
J41  89.06,9.59 0 top
J42  119,30.75 90 top
J43  98.62,125 270 top
J44  116.4,125.03 270 top
J45  116.38,67 90 top
J46  98.65,67.03 90 top
Q1  88.36,35.28 0 top
Q2  88.78,22.47 0 top
Q3  87.09,86.54 0 top
Q4  86.62,92.47 0 top
Q5  87.41,139.55 0 top
Q6  87.7,118.43 0 top
Q7  88.36,28.93 0 top
Q8  88.86,40.47 0 top
Q9  87.09,80.19 0 top
Q10  87.7,73.47 0 top
Q11  87.84,124.52 0 top
Q12  87.54,144.47 0 top
R1  92.9,34.78 180 top
R2  93.5,22.5 180 top
R3  91.63,86.54 180 top
R4  91.48,92.53 180 top
R5  90.95,139.55 180 top
R6  91.47,118.4 180 top
R7  87.09,32.74 0 top
R8  87.53,20.01 0 top
R9  85.82,84 0 top
R10  85.37,90.01 0 top
R11  86.14,137.06 0 top
R12  86.69,115.81 0 top
R13  92.9,28.93 180 top
R14  92.5,40.5 180 top
R15  91.63,80.19 180 top
R16  91.5,73.5 180 top
R17  91.38,124.52 180 top
R18  90.8,144.24 180 top
R19  87.09,26.39 0 top
R20  87.61,38.01 0 top
R21  85.82,77.65 0 top
R22  86.25,70.56 0 top
R23  86.56,121.98 0 top
R24  86.29,142.5 0 top
R25  65.05,146.05 90 top
R26  70.62,140.95 180 top
R27  61.08,100.88 270 top
R28  63.52,100.8 90 top
R29  64.58,41.23 0 top
R30  78.42,35 0 top
R31  20.77,147.3 0 top
R32  23.05,141.55 0 top
R33  20.65,97.35 315 top
R34  21.52,87.55 315 top
R35  20.77,39.73 0 top
R36  20.73,37.4 0 top
R37  101.8,142.03 0 top
R38  101.72,143.55 180 top
R39  101.65,144.85 0 top
R40  101.67,146.1 180 top
R41  101.55,147.45 0 top
R42  101.55,148.68 180 top
R43  103.08,37.65 0 top
R44  103.05,38.9 180 top
R45  103.05,40.15 0 top
R46  103.05,41.45 180 top
R47  103.03,42.73 0 top
R48  102.95,43.98 180 top
R49  102,141.22 180 top
R50  101.88,142.9 0 top
R51  101.83,144.2 180 top
R52  101.88,145.47 0 top
R53  101.75,146.75 180 top
R54  101.72,148.1 0 top
R55  103.28,36.92 180 top
R56  103.25,38.3 0 top
R57  103.22,39.58 180 top
R58  103.25,40.83 0 top
R59  103.22,42.15 180 top
R60  103.15,43.4 0 top
R61  105.05,154.03 0 top
R62  105.08,153.47 180 top
R63  105.1,152.93 0 top
R64  105.08,152.35 0 top
R65  95.25,53.77 90 top
TP1  101.35,13.95 0 top
TP2  111.12,95.08 0 top
TP3  112.67,9.8 0 top
TP4  118.97,138.88 0 top
U1  106.53,144.2 0 top
U2  107.72,39.55 0 top

### Tracks (layer width: path | path; a pad name or v marks a point on that pad's centre or on a via)
3V3  (via drill 0.35)
  Top 0.152: C22.P$2 C19.P$1 112.38,42.73 U2.15 U2.16 112.32,43.99 C22.P$2 | C22.P$2 113.53,44.08 C24.P$2 113.6,43.73 v114.22,43.1 | C21.P$2 110.85,148.65 C23.P$2 112.1,147.9 112.47,147.53 | C21.P$2 109.01,148.68 U1.16 U1.15 109.13,147.53 C18.P$1 110.83,147.7 C21.P$2 | Q12.1 85.64,145.42 84.75,144.53 84.75,142.95 85.2,142.5 | 85.2,142.5 85.2,140.5 85.22,140.5 | 85.22,140.5 Q5.1 90.53,140.5 v90.55,140.47 | R24.P$1 85.2,142.5 | 84.95,122.62 84.95,119.38 | 84.95,119.38 84.62,119.06 84.62,117.57 R12.P$1 84.58,114 v84.58,112.28 | Q6.1 84.95,119.38 | R23.P$1 85.59,121.98 84.95,122.62 | 84.95,122.62 84.65,122.92 84.65,124 86.12,125.47 Q11.1 92.17,125.47 93.62,126.92 93.62,130.78 87.75,136.65 85.9,136.65 85.84,136.71 R11.P$1 84.4,138.5 84.4,139.68 85.22,140.5 | 84.2,90.01 84.2,93 84.62,93.42 Q4.1 85.56,92.66 v85.4,92.5 | 84.2,90.01 84.2,87.49 | 84.2,87.49 84.2,84 | 84.2,84 84.2,81.14 | 84.2,81.14 84.2,77.72 | R21.P$1 84.27,77.65 84.2,77.72 | Q9.1 84.2,81.14 | R9.P$1 84.2,84 | Q3.1 84.2,87.49 | R10.P$1 84.2,90.01 | 84.2,74.42 84.2,72.31 R22.P$1 85.95,70.53 86.75,69.73 v86.75,69.23 | 84.2,74.42 84.2,77.72 | Q10.1 84.2,74.42 | 85.95,37.92 85.95,40.05 87.32,41.42 Q8.1 88.65,42.27 v88.65,42.3 | 85.95,37.92 85.95,36.23 | 85.95,36.23 85.95,32.77 | 85.95,32.77 85.95,29.9 | 85.95,29.9 85.95,26.38 | 85.95,26.38 85.95,23.38 | 85.95,23.38 85.95,21.29 R8.P$1 | Q2.1 86,23.42 85.95,23.38 | R19.P$1 85.97,26.39 85.95,26.38 | Q7.1 85.97,29.88 85.95,29.9 | Q1.1 85.95,36.23 | R20.P$1 86.03,38.01 85.95,37.92 | R7.P$1 85.98,32.74 85.95,32.77 | v94.28,49.92 90.95,46.6 v90.95,46.38 | v87,63.73 87,63.67 87.58,63.1 88.38,63.1 89.05,63.77 89.05,64.15 95,70.1 v97,70.1
  Top 0.152: v97,61.85 96.5,61.35 v96.5,54.76 96.2,54.76 96.18,54.73 95.47,54.73 R65.2 | v94.78,140.68 95.22,140.22 100.1,140.22 102.85,137.47 v105.3,137.47 | v114.25,137.75 114.25,138.07 113.38,138.95 113.38,139.38 113.85,139.85 115.55,139.85 J44.5 116.52,138.88 TP4.TP
  Top 0.254: C18.P$1 112.47,147.53 v113.1,146.9 | v113.8,73.45 v113.8,49.58 | v114.22,43.1 113.83,42.7 C19.P$1
  Bottom 0.152: v88.65,42.3 88.65,44.08 v90.95,46.38 | v84.58,112.28 84.58,96.22 85.67,95.12 85.67,92.78 v85.4,92.5 | v86.75,69.23 86.75,63.92 86.95,63.73 v87,63.73 | v97,70.1 96.97,61.88 v97,61.85 | v90.55,140.47 94.58,140.47 v94.78,140.68 | v105.3,137.47 113.97,137.47 v114.25,137.75 115,137 115,136.88 | v96.5,54.76 96.5,52.15 v94.28,49.92
  Bottom 0.254: v113.1,146.9 115,145 115,136.88 115,74.65 v113.8,73.45 | v113.8,49.58 113.8,45.35 114.33,44.83 114.33,43.2 v114.22,43.1
5V  (via drill 0.35)
  Top 0.152: 112.72,9.75 TP3.TP
  Top 0.25: J10.1 10.92,69.8 6.92,69.8 6,68.88 6,67.85 5.15,67 3.98,67 3.42,67.55 3.42,69.58 8.05,74.2 8.05,95.33 8.12,95.4 | J4.1 10.67,105.05 3.92,105.05 3.17,104.3 | 3.17,104.3 3.17,100.35 8.12,95.4 | 8.12,95.4 10.65,92.88 15.25,92.88 J35.4 | 2.23,151.95 2.23,155.95 4.58,158.3 10.42,158.3 J2.1 13.92,154.8 53.38,154.8 68.95,139.22 72.28,139.22 76.22,143.18 J27.4 | 2.23,151.95 2.23,105.25 3.17,104.3 | J33.4 14.27,146.85 14.27,149.6 11.92,151.95 2.23,151.95 | v33.9,90.33 34.12,90.1 74.7,90.1 J29.4
  Top 0.254: v93.25,36.9 93.25,40.08 92.83,40.5 R14.P$1 92.8,40.83 91.97,41.65 90.75,41.65 88.8,43.6 87.3,43.6 84.12,40.42 78.1,40.42 J31.4 75.22,37.55 24.62,37.55 23,35.92 19.2,35.92 17.73,37.4 | v93.22,35.52 93.22,34.78 R1.P$1 R13.P$1 93.8,28.33 R2.P$1 96.28,22.5 v96.35,22.58 | 92.95,80.22 92.95,85.52 R3.P$1 91.93,86.79 90.55,88.17 v90.5,88.17 | R15.P$1 91.97,80.22 92.95,80.22 | 92.95,80.22 93.12,80.22 93.12,74.83 R16.P$1 96.15,73.5 97.22,74.58 103.76,74.58 104.08,74.25 v104.1,74.25 | R6.P$1 91.78,121.35 v91.88,121.45 | v91.75,123.6 91.75,124.44 R17.P$1 92.08,124.52 95.45,127.9 95.45,133.97 94.12,135.3 | v91.28,138.68 91.25,138.7 R5.P$1 v91.25,141.6 | 3.42,51.17 3.42,49.73 5.83,47.33 24.6,47.33 25.17,46.75 25.17,45.65 24.35,44.83 15.92,44.83 15,43.9 15,40.12 J37.4 17.73,37.4 | 3.42,51.17 3.9,51.65 11.08,51.65 J6.1 | v104.7,135.15 104.55,135.3 94.12,135.3 | v91.2,143.43 91.1,143.53 R18.P$1 91.1,144.85 90.17,145.78 88,145.78 83.45,150.32 81.58,150.32 v79.8,148.55 | 3.42,51.17 3.42,67.55 | R4.P$1 91.78,92.64 91.35,93.08 v90.53,93.08 90.45,93.08 89.28,94.25 v85.05,94.25 | v78.05,93.3 77.25,93.3 76.38,92.42 J29.4 | 17.73,37.4 17.73,25 13,20.28 7.58,20.28 3.1,15.8 3.1,13.9 4.15,12.85 11.5,12.85 12.25,13.6 J12.1 | 94.12,135.3 v93.12,136.3
  Top 1.27: J40.P 112.72,9.75
  Bottom 0.25: v33.9,90.33 17.8,90.33 J35.4
  Bottom 0.254: v93.25,36.9 93.22,36.88 v93.22,35.52 | v91.88,121.45 91.88,123.47 v91.75,123.6 | v93.12,136.3 91.28,138.15 v91.28,138.68 | v96.35,22.58 109.17,9.75 J40.P | v104.7,135.15 106.91,135.15 D1.P$1 | v104.1,74.25 105,73.35 105,62.99 D2.P$1 | v91.25,141.6 91.2,141.65 v91.2,143.43 | v90.53,93.08 90.4,92.95 90.4,88.28 v90.5,88.17 | v85.05,94.25 85,94.25 84.05,93.3 v78.05,93.3 | J8.1 J4.1 | v79.8,148.55 76.22,144.97 J27.4
B+  (via drill 0.5)
  Top 0.45: R61.P$1 103.85,154.03 v103.72,153.9
  Top 2.54: TP1.TP 98.92,13.95 J41.+
  pour Route63: -1,172.3 126,172.3 126,-3.3 -1,-3.3
B-
  pour Route2: -1,172.97 126,172.97 126,-4.38 -1,-4.38
CH1A  (via drill 0.35)
  Top 0.152: Q5.3 R5.P$2 89.86,138.75 87.55,138.75 87.08,139.22 v85.08,139.22 | J2.3 9.62,154.1 52.67,154.1 v71.1,135.68
  Bottom 0.152: v71.1,135.68 73.03,135.68 73.42,136.07 81.92,136.07 v85.08,139.22
CH1A_2  (via drill 0.35)
  Top 0.152: Q6.3 88.8,118.4 R6.P$2 91.17,118.22 90.5,117.55 88.05,117.55 87.15,118.45 v85.4,118.45 | J8.3 14.4,114.33 v62.6,114.33
  Bottom 0.152: v62.6,114.33 81.28,114.33 v85.4,118.45
CH1B  (via drill 0.35)
  Top 0.152: Q11.3 R17.P$2 89.88,123.33 88.55,123.33 87.45,124.42 85.97,124.42 85.4,123.85 v85.4,123.17 | J2.4 7.6,153.62 51.71,153.62 70.93,134.4 70.93,132.1 76.25,126.78 v76.25,125.7
  Bottom 0.152: v76.25,125.7 82.88,125.7 v85.4,123.17
CH1B_2  (via drill 0.35)
  Top 0.152: Q12.3 90.28,144.47 90.5,144.25 R18.P$2 89.71,145.03 87.67,145.03 86.88,144.22 v85.38,144.22 | J8.4 5.88,122.6 49.4,122.6 v49.42,122.58
  Bottom 0.152: v49.42,122.58 52.35,122.58 59.8,130.03 79.15,130.03 85.7,136.57 85.7,143.9 v85.38,144.22
CH2A  (via drill 0.35)
  Top 0.152: Q3.3 91.3,86.54 | 91.3,86.54 R3.P$2 | J4.3 8.88,101.85 51.23,101.85 v61.62,91.45 | v63.92,82.5 63.92,85.78 v62.35,87.35 | v84.97,86.42 86.45,86.42 87.53,85.35 90.11,85.35 91.3,86.54
  Bottom 0.152: v61.62,91.45 62.35,90.72 v62.35,87.35 | v63.92,82.5 77.28,82.5 81.2,86.42 v84.97,86.42
CH2A_2  (via drill 0.35)
  Top 0.152: Q4.3 87.75,92.39 91.04,92.39 R4.P$2 91.1,92.45 v91.1,91.75 | v89.95,64.17 89.95,62.35 77.03,49.42 59.3,49.42 40.33,68.4 15.15,68.4 13.02,66.28 9.45,66.28 J10.3
  Bottom 0.152: v89.95,64.17 89.95,65.1 93.1,68.25 93.1,75.85 91.75,77.2 91.75,90.03 90.97,90.8 90.97,91.62 v91.1,91.75
CH2B  (via drill 0.35)
  Top 0.152: Q9.3 R15.P$2 90.27,81.25 87.58,81.25 86.45,80.12 v85.2,80.12 | J4.4 7.1,101.12 50.6,101.12 v60.23,91.5 | v60.83,87.3 60.85,87.3 62.58,85.58 v62.58,81.62
  Bottom 0.152: v60.23,91.5 60.23,87.9 v60.83,87.3 | v62.58,81.62 77.28,81.62 79.42,83.78 81.55,83.78 v85.2,80.12
CH2B_2  (via drill 0.35)
  Top 0.152: R16.P$2 88.79,73.5 Q10.3 88.88,73.36 v88.88,72.33 | v38.23,72.88 9.15,72.88 J10.4 | v80.85,74.1 81.5,74.1 v85.83,69.78
  Bottom 0.152: v80.85,74.1 39.45,74.1 v38.23,72.88 | v88.88,72.33 88.88,72.05 86.67,69.85 85.9,69.85 v85.83,69.78
CH3A  (via drill 0.35)
  Top 0.152: Q1.3 89.82,34.88 92.5,34.88 R1.P$2 92.6,34.67 v88.78,30.85 | J6.3 9.02,48.7 v48.52,48.7 | v62.42,34.8 66.45,30.78 v85.33,30.78
  Bottom 0.152: v62.42,34.8 v48.52,48.7 | v88.78,30.85 85.4,30.85 v85.33,30.78
CH3A_2  (via drill 0.35)
  Top 0.152: Q2.3 89.87,22.5 R2.P$2 93.2,21.62 v93.17,21.6 | J12.3 7.25,15.45 9,17.2 v88.03,17.2
  Bottom 0.152: v88.03,17.2 88.03,17.03 88.38,16.67 92.25,16.67 93.8,18.22 93.8,20.97 v93.17,21.6
CH3B  (via drill 0.35)
  Top 0.152: Q7.3 R13.P$2 92.6,28.95 v91.42,30.12 | J6.4 7.5,47.73 v47.65,47.73 | v60.77,34.73 65.38,30.12 v84.47,30.12
  Bottom 0.152: v47.65,47.73 60.65,34.73 v60.77,34.73 | v91.42,30.12 v84.47,30.12
CH3B_2
  Top 0.152: Q8.3 89.95,40.5 R14.P$2 92.2,40.7 91.62,41.27 90.58,41.27 88.8,43.05 87.45,43.05 84.08,39.67 81.28,39.67 78.7,37.1 59.2,37.1 41.33,19.22 8.23,19.22 4.75,15.75 J12.4
GND  (via drill 0.35, 0.5)
  Top 0.152: R60.P$1 103.03,43.23 103.03,42.25 R59.P$2 103.05,42.02 103.05,40.92 R58.P$1 103.05,40.73 103.05,39.7 R57.P$2 103.05,39.45 103.05,38.4 R56.P$1 103.08,38.17 103.08,37.02 R55.P$2 | R54.P$1 101.55,147.97 101.55,146.85 R53.P$2 101.67,146.53 101.67,145.57 R52.P$1 101.65,145.4 101.65,144.32 R51.P$2 101.72,144 101.72,143.05 R50.P$1 101.8,142.68 101.8,141.32 R49.P$2
  Bottom 0.152: v35.4,91.2 35.42,91.17 v35.42,87.28 | v102.5,34.08 104.4,34.08 v104.42,34.05 | v91.05,77.53 91.05,82.17 v90.83,82.4 | v63.4,98.67 65.47,100.75 v67.55,100.75
  other vias: 121.2,164.4 116.4,164.4 106.8,164.4 102,164.4 97.2,164.4 92.4,164.4 54,164.4 49.2,164.4 44.4,164.4 39.6,164.4 34.8,164.4 30,164.4 25.2,164.4 15.6,164.4 10.8,164.4 6,164.4 121.2,159.6 116.4,159.6 106.8,159.6 102,159.6 97.2,159.6 78,159.6 49.2,159.6 44.4,159.6 39.6,159.6 34.8,159.6 25.2,159.6 15.6,159.6 10.8,159.6 6,159.6 121.2,154.8 116.4,154.8 10.8,154.8 121.2,150 92.4,150 63.6,150 54,150 34.8,150 30,150 92.4,145.2 73.2,145.2 58.8,145.2 54,145.2 34.8,145.2 20.4,145.2 102,140.4 58.8,140.4 54,140.4 10.8,140.4 6,140.4 111.6,135.6 92.4,135.6 54,135.6 49.2,135.6 44.4,135.6 30,135.6 20.4,135.6 102,130.8 92.4,130.8 82.8,130.8 73.2,130.8 63.6,130.8 15.6,130.8 111.6,126 102,126 97.2,126 73.2,126 68.4,126 63.6,126 58.8,126 111.6,121.2 102,121.2 82.8,121.2 73.2,121.2 68.4,121.2 49.2,121.2 44.4,121.2 39.6,121.2 34.8,121.2 25.2,121.2 20.4,121.2 15.6,121.2 111.6,116.4 102,116.4 92.4,116.4 73.2,116.4 54,116.4 49.2,116.4 44.4,116.4 39.6,116.4 34.8,116.4 25.2,116.4 15.6,116.4 10.8,116.4 6,116.4 111.6,111.6 102,111.6 58.8,111.6 54,111.6 49.2,111.6 44.4,111.6 39.6,111.6 34.8,111.6 30,111.6 25.2,111.6 20.4,111.6 15.6,111.6 10.8,111.6 6,111.6 111.6,106.8 106.8,106.8 102,106.8 73.2,106.8 54,106.8 49.2,106.8 44.4,106.8 39.6,106.8 34.8,106.8 25.2,106.8 15.6,106.8 10.8,106.8 6,106.8 111.6,102 106.8,102 102,102 68.4,102 54,102 34.8,97.2 30,97.2 106.8,92.4 102,92.4 54,10.8 49.2,10.8 44.4,10.8 34.8,10.8 25.2,10.8 15.6,10.8 10.8,10.8 6,10.8 121.2,6 116.4,6 111.6,6 102,6 87.6,6 39.6,6 34.8,6 30,6 25.2,6 20.4,6 15.6,6 10.8,6 6,6 58.8,10.8 78,10.8 102,10.8 106.8,10.8 111.6,10.8 121.2,10.8 6,15.6 10.8,15.6 15.6,15.6 20.4,15.6 25.2,15.6 116.4,15.6 121.2,15.6 34.8,20.4 39.6,20.4 54,20.4 58.8,20.4 63.6,20.4 68.4,20.4 82.8,20.4 106.8,20.4 111.6,20.4 116.4,20.4 121.2,20.4 6,25.2 78,25.2 92.4,25.2 97.2,25.2 102,25.2 106.8,25.2 111.6,25.2 116.4,25.2 121.2,25.2 97.2,30 102,30 106.8,30 111.6,30 121.2,30 6,34.8 10.8,34.8 15.6,34.8 20.4,34.8 25.2,34.8 30,34.8 34.8,34.8 39.6,34.8 44.4,34.8 49.2,34.8 54,34.8 58.8,34.8 63.6,34.8 68.4,34.8 6,39.6 10.8,39.6 25.2,39.6 92.4,39.6 54,49.2 82.8,49.2 87.6,49.2 92.4,49.2 111.6,49.2 6,54 10.8,54 15.6,54 25.2,54 34.8,54 39.6,54 44.4,54 49.2,54 73.2,54 87.6,54 92.4,54 97.2,54 102,54 6,58.8 10.8,58.8 15.6,58.8 20.4,58.8 25.2,58.8 30,58.8 34.8,58.8 39.6,58.8 97.2,58.8 102,58.8 111.6,58.8 6,63.6 10.8,63.6 15.6,63.6 25.2,63.6 34.8,63.6 54,63.6 73.2,63.6 102,63.6 102,68.4 111.6,68.4 44.4,73.2 49.2,73.2 54,73.2 63.6,73.2 68.4,73.2 97.2,73.2 102,73.2 6,78 15.6,78 20.4,78 25.2,78 39.6,78 44.4,78 49.2,78 54,78 63.6,78 68.4,78 82.8,78 97.2,78 111.6,78 34.8,82.8 39.6,82.8 44.4,82.8 49.2,82.8 54,82.8 6,87.6 10.8,87.6 15.6,87.6 106.8,87.6 34.8,92.4 54,92.4 63.6,92.4
  pour Top: -1,171.7 126,171.7 126,-2.03 -1,-2.03
  pour Bottom: -1,171.05 126,171.05 126,-1.03 -1,-1.03
GP2  (via drill 0.35)
  Top 0.152: v94.83,143.62 96.94,141.51 J43.4
  Bottom 0.152: J15.4 70.55,152.25 74.1,148.7 76.88,148.7 77.83,149.65 77.83,153.72 86.08,161.97 88.28,161.97 94.83,155.43 v94.83,143.62
GP2_2  (via drill 0.35)
  Top 0.152: J21.4 24.6,152.25 24.7,152.15 49.6,152.15 58.02,143.72 58.02,132.6 66.25,124.38 66.25,92.35 v66.33,92.28 | v66.05,87.35 67.22,86.17 67.22,64 75,56.23 80.03,56.23 80.67,56.88 v82.25,56.88 | v105.53,56.7 108.45,56.7 v111.65,53.5
  Bottom 0.152: v66.33,92.28 66.33,87.62 v66.05,87.35 | v105.53,56.7 105.5,56.73 82.4,56.73 v82.25,56.88 | v111.65,53.5 114.72,50.42 116.31,50.42 J45.4
GP3
  Bottom 0.152: J27.1 76.22,153.78 85.25,162.81 88.7,162.81 96.71,154.8 96.71,140.89 J43.5
GP3_2  (via drill 0.35)
  Top 0.152: v36.1,155.68 36.5,155.28 112.39,155.28 120.28,147.39 120.28,56.37 116.94,53.03 J45.5
  Bottom 0.152: J33.1 20.75,152.25 23.48,154.97 35.4,154.97 v36.1,155.68
GP4
  Top 0.152: Q5.2 86.44,138.5 R11.P$2 98,137.06 J43.6
GP4_2
  Top 0.152: Q6.2 86.98,117.14 R12.P$2 88.31,115.81 95.85,108.27 95.85,100.05 98.58,97.33 117.78,97.33 118.97,96.12 118.97,58.17 J45.6
GP5
  Top 0.152: Q11.2 86.86,123.48 R23.P$2 91.06,121.98 97,127.92 97,132.45 98.44,133.89 J43.7
GP5_2  (via drill 0.35)
  Top 0.152: Q12.2 86.59,143.41 R24.P$2 92,142.5 97,137.5 v101.47,137.5 | J45.7 115.03,56.76 115.03,54.75 115.55,54.23 117.7,54.23 119.65,56.17 119.65,136.25 118.15,137.75 115.58,137.75 v114.22,139.1
  Bottom 0.152: v114.22,139.1 103.08,139.1 v101.47,137.5
GP6
  Top 0.152: J27.2 J15.3
  Bottom 0.152: J43.9 97.66,128.81 95.97,130.5 95.97,154.88 88.47,162.38 85.58,162.38 77.42,154.22 77.42,150.95 J27.2
GP6_2  (via drill 0.35)
  Top 0.152: J33.2 J21.3 26.1,149.75 v53.55,122.3 | v71.4,87.33 71.4,70.1 v77.42,64.08 | v80.78,61.85 80.78,59.9 v83.3,57.38 | v106.1,60.5 108.78,63.17 112.2,63.17 v112.22,63.2
  Bottom 0.152: v53.55,122.3 65.58,110.28 65.58,102.75 62.65,99.83 62.65,97.2 67.38,92.47 67.38,91.35 v71.4,87.33 | v80.78,61.85 79.65,61.85 v77.42,64.08 | v83.3,57.38 93.92,57.38 94.22,57.08 102.8,57.08 106.1,60.38 v106.1,60.5 | v112.22,63.2 v112.23,63.19 J45.9
GP7  (via drill 0.35)
  Top 0.152: J17.3 J29.2 76.62,96.78 87.58,107.72 v92.9,107.72
  Bottom 0.152: v92.9,107.72 97.47,112.3 100.05,112.3 101.2,113.45 101.2,123.85 98.78,126.27 J43.10
GP7_2  (via drill 0.35)
  Top 0.152: J35.2 14.85,98.28 14.85,99.9 15.6,100.65 19.92,100.65 J23.3 31.62,88.95 v72.08,88.95 | v72.4,87.28 72.4,70.65 v76.66,66.39 | v87.92,63.75 88.15,63.75 95.67,71.28 v97,71.28 | v103.1,69.58 108.62,69.58 v109.12,69.08 | v109.17,66.28 112.45,66.28 v112.53,66.2
  Bottom 0.152: v72.4,87.28 72.4,88.62 v72.08,88.95 | v76.66,66.39 80,63.05 87.22,63.05 v87.92,63.75 | v97,71.28 97,71.05 98.47,69.58 v103.1,69.58 | v109.12,69.08 109.12,66.33 v109.17,66.28 | v112.53,66.2 113,65.73 J45.10
GP8  (via drill 0.35)
  Top 0.152: Q3.2 86.12,85.5 R9.P$2 90.12,84 v90.58,84.45 | J43.11 96.7,121.81 v96.7,100.55 | v97.03,88.65 97,88.62 93.12,88.62 92.92,88.83 v92.88,88.83 | v91.67,91 91.1,90.42 v91.1,89.7
  Bottom 0.152: v96.7,100.55 96.7,88.97 v97.03,88.65 | v91.1,89.7 91.15,89.65 91.15,85.03 v90.58,84.45 | v91.67,91 92.62,91 93.2,90.42 93.2,89.15 v92.88,88.83
GP8_2  (via drill 0.35)
  Top 0.152: Q4.2 85.67,91.41 R10.P$2 89.82,90.01 97.5,82.33 99.58,82.33 108.8,73.1 v110.55,73.1
  Bottom 0.152: v110.55,73.1 115.38,68.27 J45.11
GP9  (via drill 0.35)
  Top 0.152: R21.P$2 86.12,79.15 Q9.2 92.36,79.24 v92.38,79.25 | J43.12 101.28,118.54 v101.28,98.03 | v97.53,94.6 92.8,89.88 v92.5,89.88
  Bottom 0.152: v101.28,98.03 101.25,98 100.92,98 v97.53,94.6 | v92.5,89.88 92.22,89.6 92.22,79.4 v92.38,79.25
GP9_2  (via drill 0.35)
  Top 0.152: Q10.2 86.55,72.43 R22.P$2 88.47,70.56 90.22,72.3 111.7,72.3 v112.05,72.65
  Bottom 0.152: v112.05,72.65 114.53,72.65 J45.12
GP10  (via drill 0.35)
  Top 0.152: J17.4 73.19,99.27 84.7,110.78 v91.2,110.78
  Bottom 0.152: v91.2,110.78 96.53,116.11 J43.14
GP10_2
  Top 0.152: J23.4 33.5,89.58 77.2,89.58 80.3,92.67 81.9,92.67 86.03,96.8 116.15,96.8 118.28,94.67 118.28,77.79 J45.14
GP11  (via drill 0.35)
  Top 0.152: v91.65,109.08 85.05,109.08 76.38,100.4 J29.1
  Bottom 0.152: v91.65,109.08 96.15,113.57 J43.15
GP11_2
  Top 0.152: J45.15 117.62,79.68 117.62,84.12 117.03,84.72 95.78,84.72 92.28,88.22 92.25,88.22 91.83,88.65 91.83,90.25 92.44,90.86 92.44,93.14 91.8,93.78 90.33,93.78 89.22,94.88 84.78,94.88 83.15,93.25 83.15,89.55 81.58,87.97 24.67,87.97 20.67,91.97 20.67,94.95 J35.1
GP12  (via drill 0.35)
  Top 0.152: Q1.2 87.3,32.83 R7.P$2 88.11,32.74 89.38,34 v89.38,34.05 | v90.55,101.1 84,101.1 79,96.1 79,92.42 v78.78,92.2 | v75.3,87.3 74.9,86.9 74.9,70.65 79.83,65.72 79.83,57.4 v80.03,57.2
  Bottom 0.152: J43.16 100.7,108.95 100.7,102.97 99.7,101.97 91.28,101.97 90.55,101.25 v90.55,101.1 | v78.78,92.2 78.78,90.42 75.65,87.3 v75.3,87.3 | v80.03,57.2 80.03,56.17 79.78,55.92 79.78,48.85 89.38,39.25 v89.38,34.05
GP12_2
  Top 0.152: Q2.2 87.72,20.12 R8.P$2 88.25,20.44 93.41,20.44 94.87,21.9 97.17,21.9 99.5,24.22 99.5,36.95 100.62,38.08 100.62,43.2 103.5,46.08 111.28,46.08 114.42,49.23 114.42,79.02 J45.16
GP13  (via drill 0.35)
  Top 0.152: Q7.2 87.39,27.89 R19.P$2 88.22,27.22 88.22,30.28 88,30.5 v88,32.12 | v90.53,102.17 84.2,102.17 78.67,96.65 78.67,93 78.05,92.38 v78.05,91.65 | v74.38,87.3 74.38,70.62 79.12,65.88 v79.12,56.92
  Bottom 0.152: J43.17 100.3,106.81 100.3,103.2 99.4,102.3 90.65,102.3 v90.53,102.17 | v78.05,91.65 78.05,90.97 v74.38,87.3 | v79.12,56.92 79.12,48.85 88,39.98 v88,32.12
GP13_2
  Top 0.152: Q8.2 87.8,38.12 R20.P$2 89.76,36.16 98.11,36.16 100.2,38.25 100.2,43.42 103.28,46.5 111.03,46.5 113.15,48.62 113.15,79.95 116.38,83.17 J45.17
GP14  (via drill 0.35)
  Top 0.152: v65,57.67 59.35,63.33 v59.35,74.8 | v57.8,83.05 57.8,86.85 57.33,87.33 v57.3,87.33 | v62.27,112.45 63.38,113.55 v63.38,113.62 | v85.35,113.58 89.6,113.58 v90.58,112.6
  Bottom 0.152: v65,57.67 65.28,57.4 65.28,50.17 69.08,46.38 J19.4 | v59.35,74.8 59.35,81.5 v57.8,83.05 | v57.3,87.33 57.3,95.65 64.97,103.33 64.97,109.75 v62.27,112.45 | v63.38,113.62 85.3,113.62 v85.35,113.58 | v90.58,112.6 90.55,112.6 90.22,112.28 90.22,108.08 94.89,103.41 J43.19
GP14_2  (via drill 0.35)
  Top 0.152: J25.4 22.92,45.2 15.77,45.2 14.4,43.83 14.4,27.88 v16.45,25.83 | v30.12,16.4 30.15,16.38 114.48,16.38 122.55,24.44 122.55,82.4 v122.53,82.42
  Bottom 0.152: v16.45,25.83 20.88,25.83 30.12,16.58 v30.12,16.4 | v122.53,82.42 116.38,88.58 J45.19
GP15  (via drill 0.35)
  Top 0.152: J31.1 97.12,66.95 108.22,66.95 112.76,71.49 112.76,82.11 v110.9,83.97
  Bottom 0.152: v110.9,83.97 113.88,86.95 113.88,98.88 112.03,100.72 98.77,100.72 J43.20
GP15_2  (via drill 0.35)
  Top 0.152: J37.1 13.88,43.75 13.88,27.1 v15.12,25.85 | v30.98,15.58 114.49,15.58 123.5,24.58 v123.5,84.05
  Bottom 0.152: v15.12,25.85 15.85,25.12 20.4,25.12 30.08,15.45 30.85,15.45 v30.98,15.58 | v123.5,84.05 116.42,91.13 J45.20
GP16
  Top 0.152: J44.20 106.62,110.67 106.62,142.12 108.06,143.56 U1.12
GP16_2  (via drill 0.35)
  Top 0.152: U2.12 109,38.91 109,44.45 v109.78,45.23
  Bottom 0.152: v109.78,45.23 109.83,45.27 109.83,79.98 J46.20
GP17
  Top 0.152: U1.10 108.25,141.03 107.35,140.12 107.35,112.48 J44.19
GP17_2  (via drill 0.35)
  Top 0.152: U2.10 109.2,36.38 108.33,37.25 108.33,43.92 107,45.25 v106.83,45.25
  Bottom 0.152: v106.83,45.25 106.83,72.47 99.62,79.67 97.72,79.67 96.9,80.5 96.9,86.86 J46.19
GP18
  Top 0.152: U1.13 108.09,144.84 105.92,142.68 105.92,109.4 115.8,99.53 117.03,99.53 117.85,100.35 117.85,107.06 J44.17
GP18_2  (via drill 0.35)
  Top 0.152: v112.25,39.92 110.44,39.92 U2.13
  Bottom 0.152: J46.17 101.14,83.53 107.78,76.9 107.78,44.4 v112.25,39.92
GP19
  Top 0.152: U1.11 109.35,142.3 113.62,138.03 113.62,113.53 116.09,111.06 J44.16
GP19_2  (via drill 0.35)
  Top 0.152: U2.11 109.16,37.65 108.65,38.15 108.65,45.08 v108.58,45.15
  Bottom 0.152: v108.58,45.15 108.47,45.25 108.47,77.58 101.25,84.8 98.15,84.8 97.42,84.08 97.42,82.2 98.63,81 J46.16
GP22  (via drill 0.35)
  Top 0.152: J31.2 76.38,43.8 | 76.38,43.8 J19.3 | J44.12 118.53,119.09 118.53,100.09 116.41,97.97 v112.17,97.97 | v107.47,83.8 107.47,76.78 v106.95,76.25 | v105.67,74.92 104.12,73.38 v104.12,72.97 | v95.88,57.85 95.88,58.12 95.58,58.42 91,58.42 76.38,43.8
  Bottom 0.152: v112.17,97.97 112.17,88.5 v107.47,83.8 | v106.95,76.25 105.67,74.97 v105.67,74.92 | v104.12,72.97 104.12,67.1 99.05,62.02 98.08,62.02 95.88,59.83 v95.88,57.85
GP22_2
  Top 0.152: J37.2 J25.3 63.7,43.75 68.88,48.92 77.34,48.92 98.65,70.23 J46.12
M1+
  Bottom 3: J14.P 4.6,143.4 J1.P
M1+_2
  Bottom 3: J7.P 7.92,131.07 7.92,127.92 10.42,125.42 51.85,125.42 64.3,137.88 78.83,137.88 82.35,141.4 J20.P
M1-
  Bottom 3: J1.N 11.6,148.5 J14.N
M1-_2  (via drill 2.5)
  Top 3: v4.8,124.67 13.42,124.67 v17.67,128.93
  Bottom 3: J7.N 4.5,124.97 v4.8,124.67 | v17.67,128.93 17.83,128.78 50.48,128.78 62.8,141.1 76.45,141.1 77.47,141.39 arc63 78.77,142.8 79.33,145.5 81.1,146.38 arc64 J20.N
M2+
  Bottom 3: J16.P 4.6,90.4 J3.P
M2+_2
  Bottom 3: J9.P 4.52,81.5 8.25,85.22 76.1,85.22 80.9,90.03 J22.P
M2-
  Bottom 3: J3.N 11.6,95.5 J16.N
M2-_2  (via drill 2.5)
  Top 3: v92.12,98.8 84.35,98.8 J22.N
  Bottom 3: J9.N 8.9,72.1 29.7,72.1 42.05,59.75 88.4,59.75 94.95,66.3 94.95,95.97 v92.12,98.8
M3+
  Bottom 3: J18.P 4.6,37.4 J5.P
M3+_2
  Bottom 3: J11.P 8.3,32.3 23.38,32.3 30.62,25.05 73.53,25.05 82.5,34.02 J24.P
M3-
  Bottom 3: J5.N 11.6,42.5 J18.N
M3-_2  (via drill 2.5)
  Top 3: v33.65,32.62 v20.08,22.6
  Bottom 3: J11.N 8.4,19.6 17.08,19.6 v20.08,22.6 | J24.N 82.5,42.4 79.99,39.89 77.01,33.13 74.28,30.42 35.85,30.42 v33.65,32.62
N$1
  Top 0.152: D1.P$2 J44.2 | J44.2
N$2
  Top 0.152: J46.2 104.7,51.49 D2.P$2
N$3  (via drill 0.35)
  Top 0.152: J17.2 67.15,96.01 67.15,99.47 68.95,101.28 72.83,101.28 78.65,107.1 78.65,148.97 80.46,150.79 98.89,150.79 99.75,149.93 99.75,145.53 100.42,144.85 R39.P$1 | v63.33,97.67 R27.2
  Bottom 0.152: v63.33,97.67 66.73,94.27 J17.2
N$4  (via drill 0.35)
  Top 0.152: R40.P$2 100.1,147.18 100.1,150.28 99.03,151.35 80.25,151.35 78.33,149.43 78.33,110.67 76.3,108.65 68.33,108.65 66.78,107.1 66.78,94.9 68.65,93.03 74.22,93.03 75.47,94.28 J29.3 | R28.1 63.52,99.53 v64.33,98.72
  Bottom 0.152: v64.33,98.72 67.55,95.5 75.15,95.5 J29.3
N$5  (via drill 0.35)
  Top 0.152: v94.15,145.57 96.95,142.78 100.55,142.78 R37.P$1 | R25.2 65.3,147.25 J15.2
  Bottom 0.152: J15.2 69.97,148.35 77.1,148.35 78.38,149.62 78.38,153.75 86.17,161.55 88.22,161.55 94.44,155.33 94.44,145.87 v94.15,145.57
N$6
  Top 0.152: R52.P$2 R40.P$1 U1.3 104.58,146.1 106.83,148.35 106.83,150.78 C6.P$1
N$7
  Top 0.152: R51.P$1 102.15,144.22 R39.P$2 102.16,144.84 U1.4 104.48,144.84 107.2,147.55 107.2,150.2 107.95,150.95 C13.P$1
N$8  (via drill 0.35)
  Top 0.152: v85.38,150.05 89.08,146.35 96.35,146.35 97.35,145.35 99.05,145.35 100.3,144.1 100.3,144.07 100.83,143.55 R38.P$2 | J27.3 71.58,142.6 R26.1
  Bottom 0.152: J27.3 77.22,147.25 80.8,150.82 84.6,150.82 v85.38,150.05
N$9
  Top 0.152: R38.P$1 102.25,143.55 | 102.25,143.55 104.06,143.55 U1.5 104.39,143.56 107.6,146.78 107.6,149.45 C8.P$2 | R50.P$2 102.17,143.47 102.25,143.55
N$10
  Top 0.152: U1.6 103.8,142.03 R37.P$2 R49.P$1 102.8,140.72 102.8,139.15 C12.P$2
N$11  (via drill 0.35)
  Top 0.152: R41.P$1 100.53,147.97 100.53,149.18 v100.85,149.5 | v90.85,111.62 80.28,111.62 v80.03,111.38 | v64.15,112.8 58.58,107.22 v58.58,95.6 | v58.5,87.33 v58.5,56.55 | J19.2 65.6,41.3 R29.2
  Bottom 0.152: v100.85,149.5 100.85,128.9 99.53,127.58 97.78,127.58 94.6,124.4 94.6,115.38 v90.85,111.62 | v80.03,111.38 65.58,111.38 v64.15,112.8 | v58.58,95.6 58.58,87.4 v58.5,87.33 | v58.5,56.55 58.5,51.88 J19.2
N$12  (via drill 0.35)
  Top 0.152: R42.P$2 101.53,149.15 101.53,149.8 96.8,154.53 82.62,154.53 78,149.9 78,111.33 v77.33,110.65 | v73.33,87.3 73.33,70.92 78.05,66.2 v78.05,56.88 | R30.1 75.78,35 v74.33,36.45
  Bottom 0.152: v77.33,110.65 77.42,110.55 77.42,91.25 73.47,87.3 v73.33,87.3 | v78.05,56.88 78.05,42.88 J31.3 74.33,39.15 v74.33,36.45
N$13
  Top 0.152: R54.P$2 102.03,148.65 R42.P$1 104.04,148.68 U1.1 105.17,148.65 105.95,149.43 105.95,151.9 C14.P$2
N$14
  Top 0.152: R53.P$1 R41.P$2 102.12,147.38 U1.2 104.09,147.4 104.67,147.4 106.45,149.18 106.45,150.93 107.33,151.8 107.33,152.68 107.8,153.15 C9.P$2
N$15
  Top 4: H4.1 87.85,66.65 82.42,66.65 77.3,71.78 77.3,79.08 79.67,81.45 J32.P
N$16  (via drill 0.35)
  Top 0.152: v25.85,89.25 25.85,92.22 J23.2 23.75,94.25 R33.2 | v25.67,87.33 25.92,87.33 57.45,55.8 80.8,55.8 v81.22,56.23 | R45.P$1 102.38,40.15 v101.33,39.1
  Bottom 0.152: v25.67,87.33 25.73,87.38 25.73,89.12 v25.85,89.25 | v81.22,56.23 83.05,56.23 96.78,42.5 96.78,39.27 98.2,37.85 100.08,37.85 v101.33,39.1
N$17  (via drill 0.35)
  Top 0.152: 22.41,89.71 56.98,55.15 v80.58,55.15 | 22.41,89.71 17.88,94.25 J35.3 | v101.53,40.38 101.53,40.42 R46.P$2 | R34.1 22.34,89.71 22.41,89.71
  Bottom 0.152: v80.58,55.15 83.12,55.15 96.3,41.98 96.3,39.02 97.9,37.42 100.88,37.42 102,38.55 102,39.9 v101.53,40.38
N$18
  Top 0.152: R58.P$2 R46.P$1 U2.3 106.22,41.45 107.35,40.33 107.35,33.75 C7.P$1
N$19
  Top 0.152: R57.P$1 103.55,39.6 R45.P$2 105.23,40.15 | 105.23,40.15 U2.4 | C16.P$1 105.78,33.52 107.03,34.77 107.03,39.02 105.9,40.15 105.23,40.15
N$20  (via drill 0.35)
  Top 0.152: v65.33,91.15 65.67,91.5 65.67,119.53 63.75,121.45 53.45,121.45 31.05,143.85 27.17,143.85 J21.2 23.73,147.3 R31.2 | v65.05,87.3 66.2,86.15 66.2,59.25 v67.9,57.55 | v72.62,35.8 76.95,31.48 v84.65,31.48 | v102.45,35.98 102.45,37.52 R43.P$1
  Bottom 0.152: v65.33,91.15 65.33,87.58 v65.05,87.3 | v67.9,57.55 67.42,57.08 67.42,50.55 72.62,45.35 v72.62,35.8 | v84.65,31.48 94,31.48 98.5,35.98 v102.45,35.98
N$21  (via drill 0.35)
  Top 0.152: J33.3 20.65,142.97 | 20.65,142.97 30.93,142.97 58.75,115.15 62.83,115.15 65,112.97 65,92.55 v64.65,92.2 | v63.98,87.3 65.12,86.15 65.12,59.45 67.97,56.6 v69.88,56.6 | v94.6,57.77 94.1,57.27 94.1,51.65 97.08,48.67 97.08,45.95 v97.05,45.92 | v96.9,43.5 96.9,40.95 98.42,39.42 98.42,37.5 v97.72,36.8 | v101.45,37.02 101.45,37.8 R44.P$2 | 20.65,142.97 22.08,141.55 R32.1
  Bottom 0.152: v64.65,92.2 64.65,87.97 v63.98,87.3 | v69.88,56.6 76.75,56.6 78.15,58 94.38,58 v94.6,57.77 | v97.05,45.92 97.05,43.65 v96.9,43.5 | v97.72,36.8 101.22,36.8 v101.45,37.02
N$22
  Top 0.152: R56.P$2 R44.P$1 105.25,38.9 U2.5 105.98,38.91 106.65,38.25 106.65,34.88 104.9,33.12 104.9,30.75 107.3,28.35 C10.P$2
N$23
  Top 0.152: U2.6 R43.P$2 R55.P$1 103.58,36.77 103.55,36.75 103.55,30.85 107.28,27.12 C15.P$2
N$24  (via drill 0.35)
  Top 0.152: v97.67,39.25 97.62,39.25 94.8,42.08 90.9,42.08 88.12,44.85 81.83,44.85 76.97,40 25.83,40 24.58,41.25 J25.2 23.25,41.25 R35.2 | v101.5,41.7 R47.P$1
  Bottom 0.152: v97.67,39.25 99.05,39.25 v101.5,41.7
N$25  (via drill 0.35)
  Top 0.152: v98.55,40.3 97.53,41.33 97.53,44.12 96.2,45.45 81.42,45.45 78.62,42.65 17.79,42.65 J37.3 19.77,37.85 R36.1 | R48.P$2 101.38,42.9 v101.3,42.9
  Bottom 0.152: v101.3,42.9 98.7,40.3 v98.55,40.3
N$26
  Top 0.152: R60.P$2 R48.P$1 105.25,43.98 U2.1 106.75,43.99 108,42.75 108,35.55 C17.P$2
N$27
  Top 0.152: R59.P$1 R47.P$2 U2.2 106.05,42.73 107.67,41.1 107.67,34.7 C11.P$2
N$28
  Bottom 4: H5.1 91.2,19.7 82.45,28.45 J34.P
N$29
  Top 4: J36.P 84.72,134.4 H6.1
N$30
  Bottom 3.75: 75.22,7.62 79.88,2.97 106.03,2.97 H3.1
  Bottom 4: J30.P 21.8,28.4 42.58,7.62 75.22,7.62
N$31
  Bottom 4: H2.1 87.12,155.38 87.95,154.55 87.95,77.42 80.83,70.3 36.67,70.3 25.52,81.45 J28.P
N$32
  Route63 3.25: 59.58,162.6 85.58,162.6
  Route63 4: J26.P 16.05,138.75 35.73,138.75 59.58,162.6 | 85.58,162.6 H1.1
N$33
  Top 0.152: J46.5 98.63,53.04 R65.1
N$34
  Top 0.152: R62.P$2 104.8,153.45 R63.P$1
N$35
  Top 0.152: R61.P$2 105.38,154 R62.P$1
N$37  (via drill 0.35)
  Top 0.152: R63.P$2 105.38,152.9 R64.P$2 105.33,152.3 C20.P$1 v105.33,150.2 | U1.7 104.88,141.03 105.55,141.7 105.55,143.4 v105.62,143.47
  Bottom 0.152: v105.62,143.47 105.62,149.9 v105.33,150.2
RX  (via drill 0.35)
  Top 0.152: v121.65,147.18 121.65,34.12 J42.2
  Bottom 0.152: J43.2 97.53,147.69 97.53,149.85 99.85,152.18 116.65,152.18 v121.65,147.18
RX2
  Top 0.152: J42.4 115.22,31.31 115.22,44.67 115.96,45.41 J45.2
TX  (via drill 0.35)
  Top 0.152: J42.1 121.03,36 121.03,146.4 v121,146.43
  Bottom 0.152: v121,146.43 115.85,151.57 101.07,151.57 J43.1
TX2
  Top 0.152: J45.1 115.72,42.22 115.72,33.31 J42.3

### Text on the board
Top: HP | HR | + | K
Bottom: HR | HP | K
SilkscreenTop: + / - / / - / + | 1 | + | 1 | + | - | + | +
SilkscreenBottom: +